# EasyEDA Pro project 不晦启明_srm A.eprj, schematic car

## Sheets
1 MCU: Board Name: Board1; Create Date: 2026-10-12; Page Name: MCU; Project Name: 不晦启明_srm A; Schematic Name: car; Update Date: 2026-10-12; Company: 嘉立创EDA; Page Size: A4; Version: V1.0
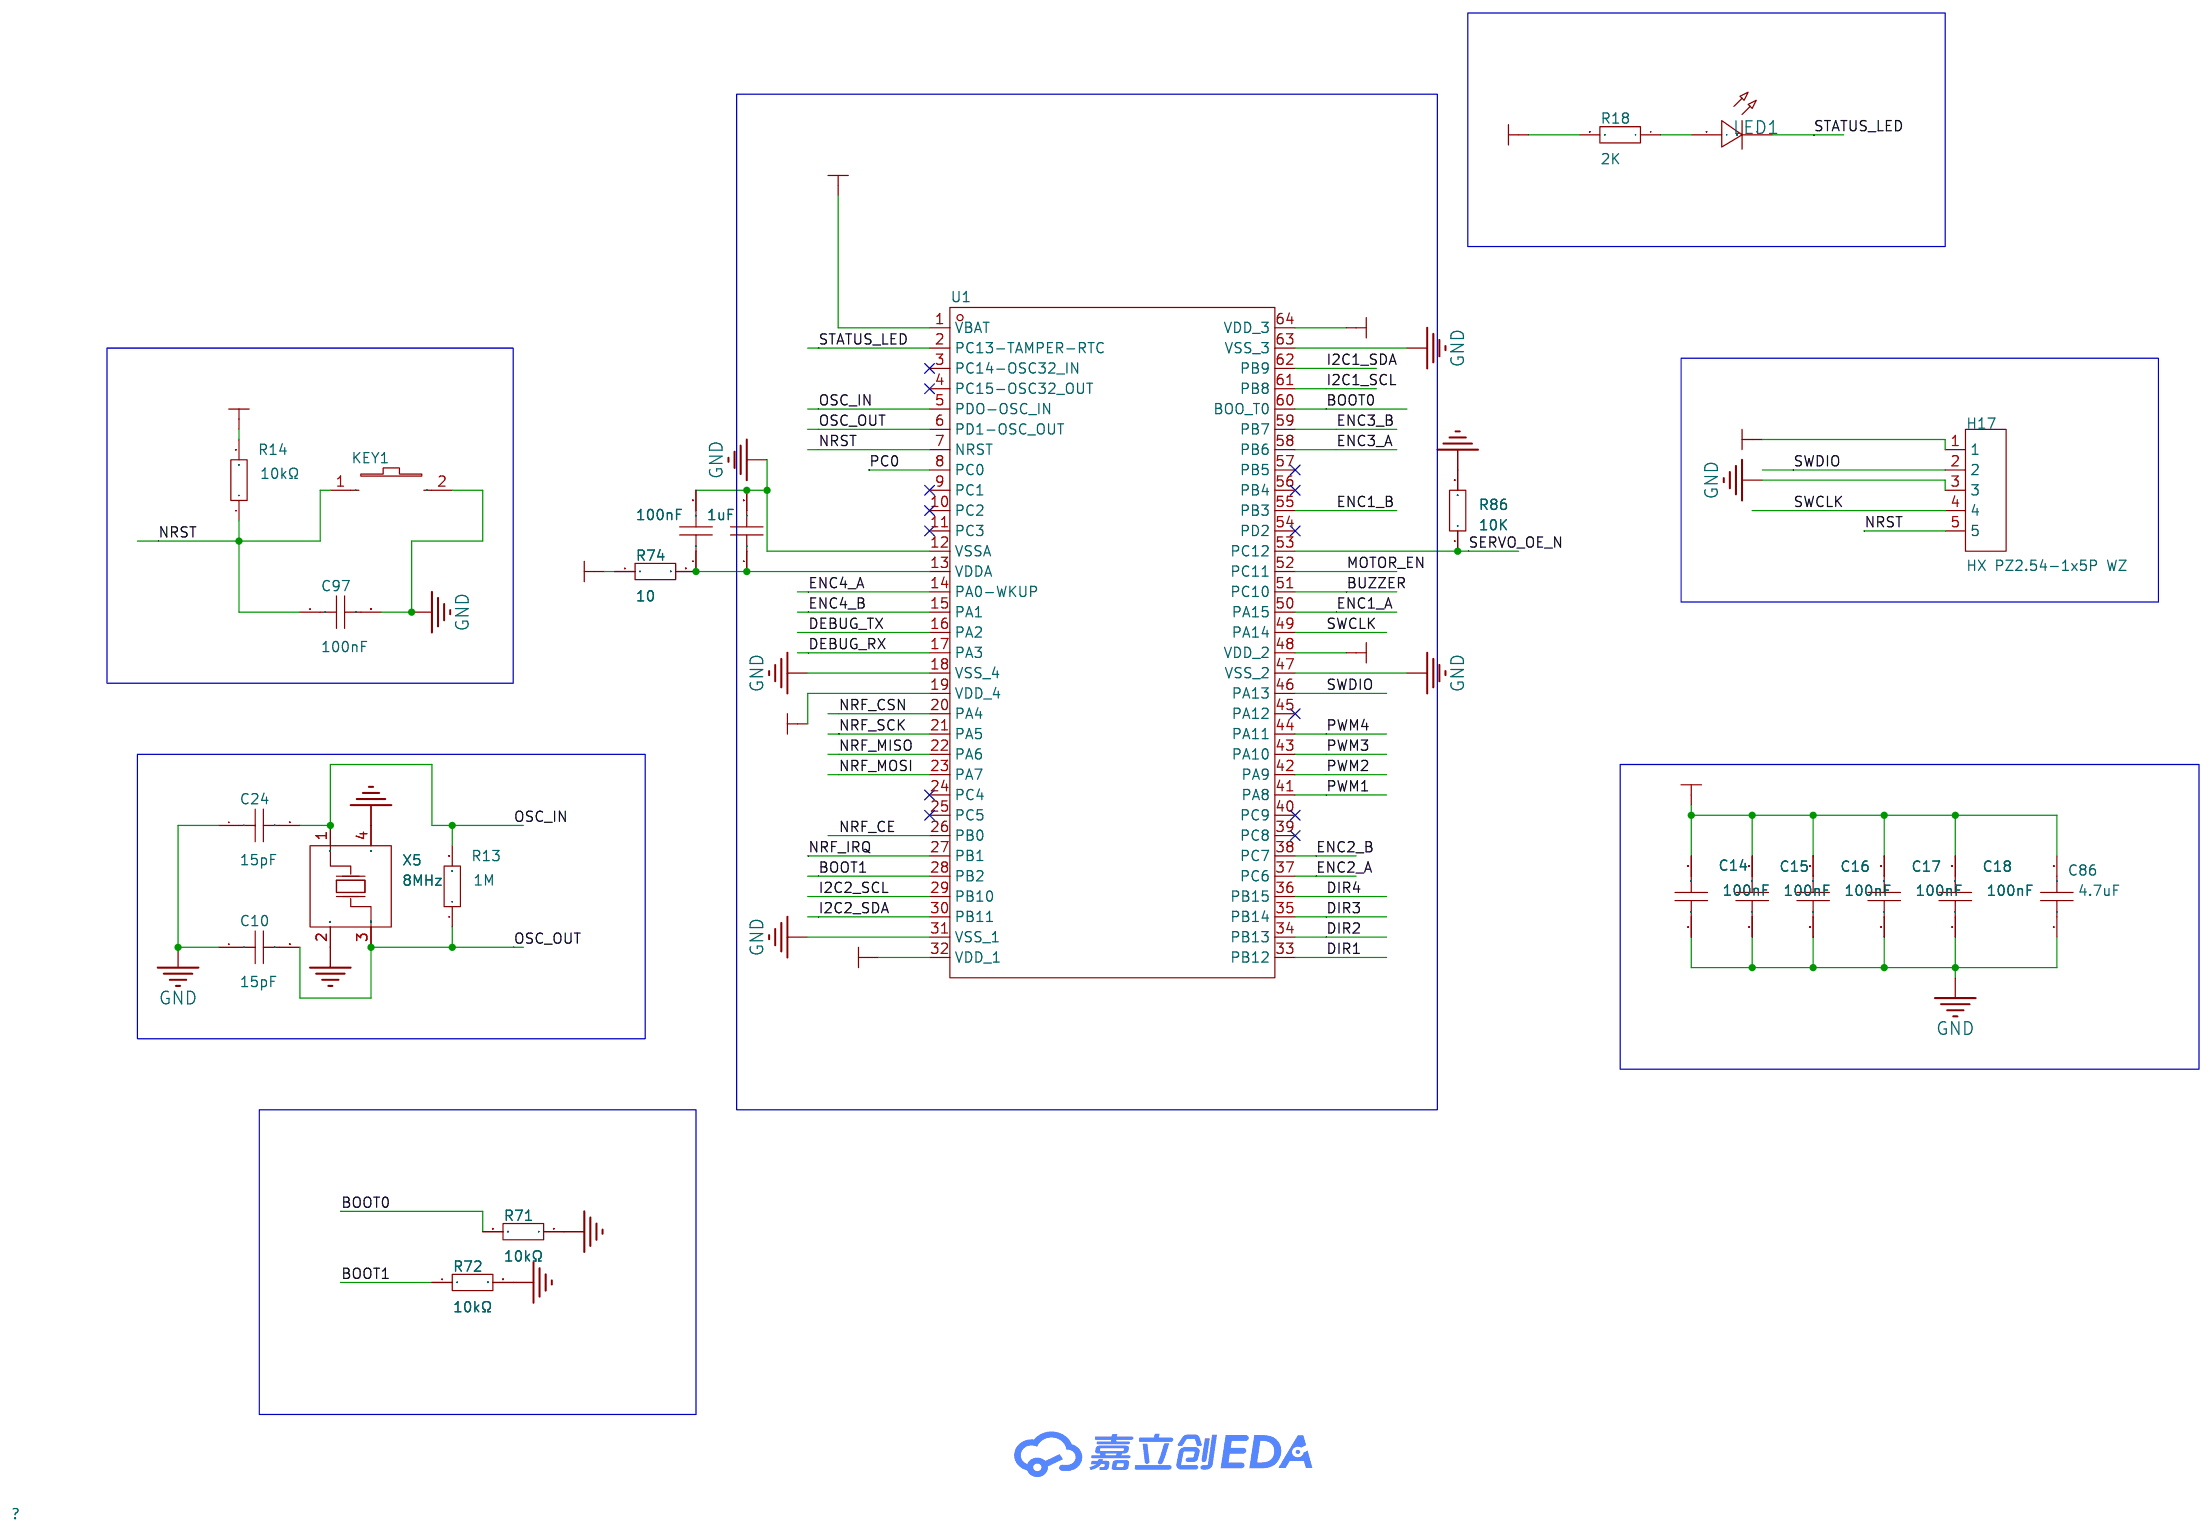
[diagram p0: MCU]
2 电机驱动模块: Create Date: 2026-09-29; Page Name: 电机驱动模块; Project Name: 不晦启明_srm; Update Date: 2026-10-09
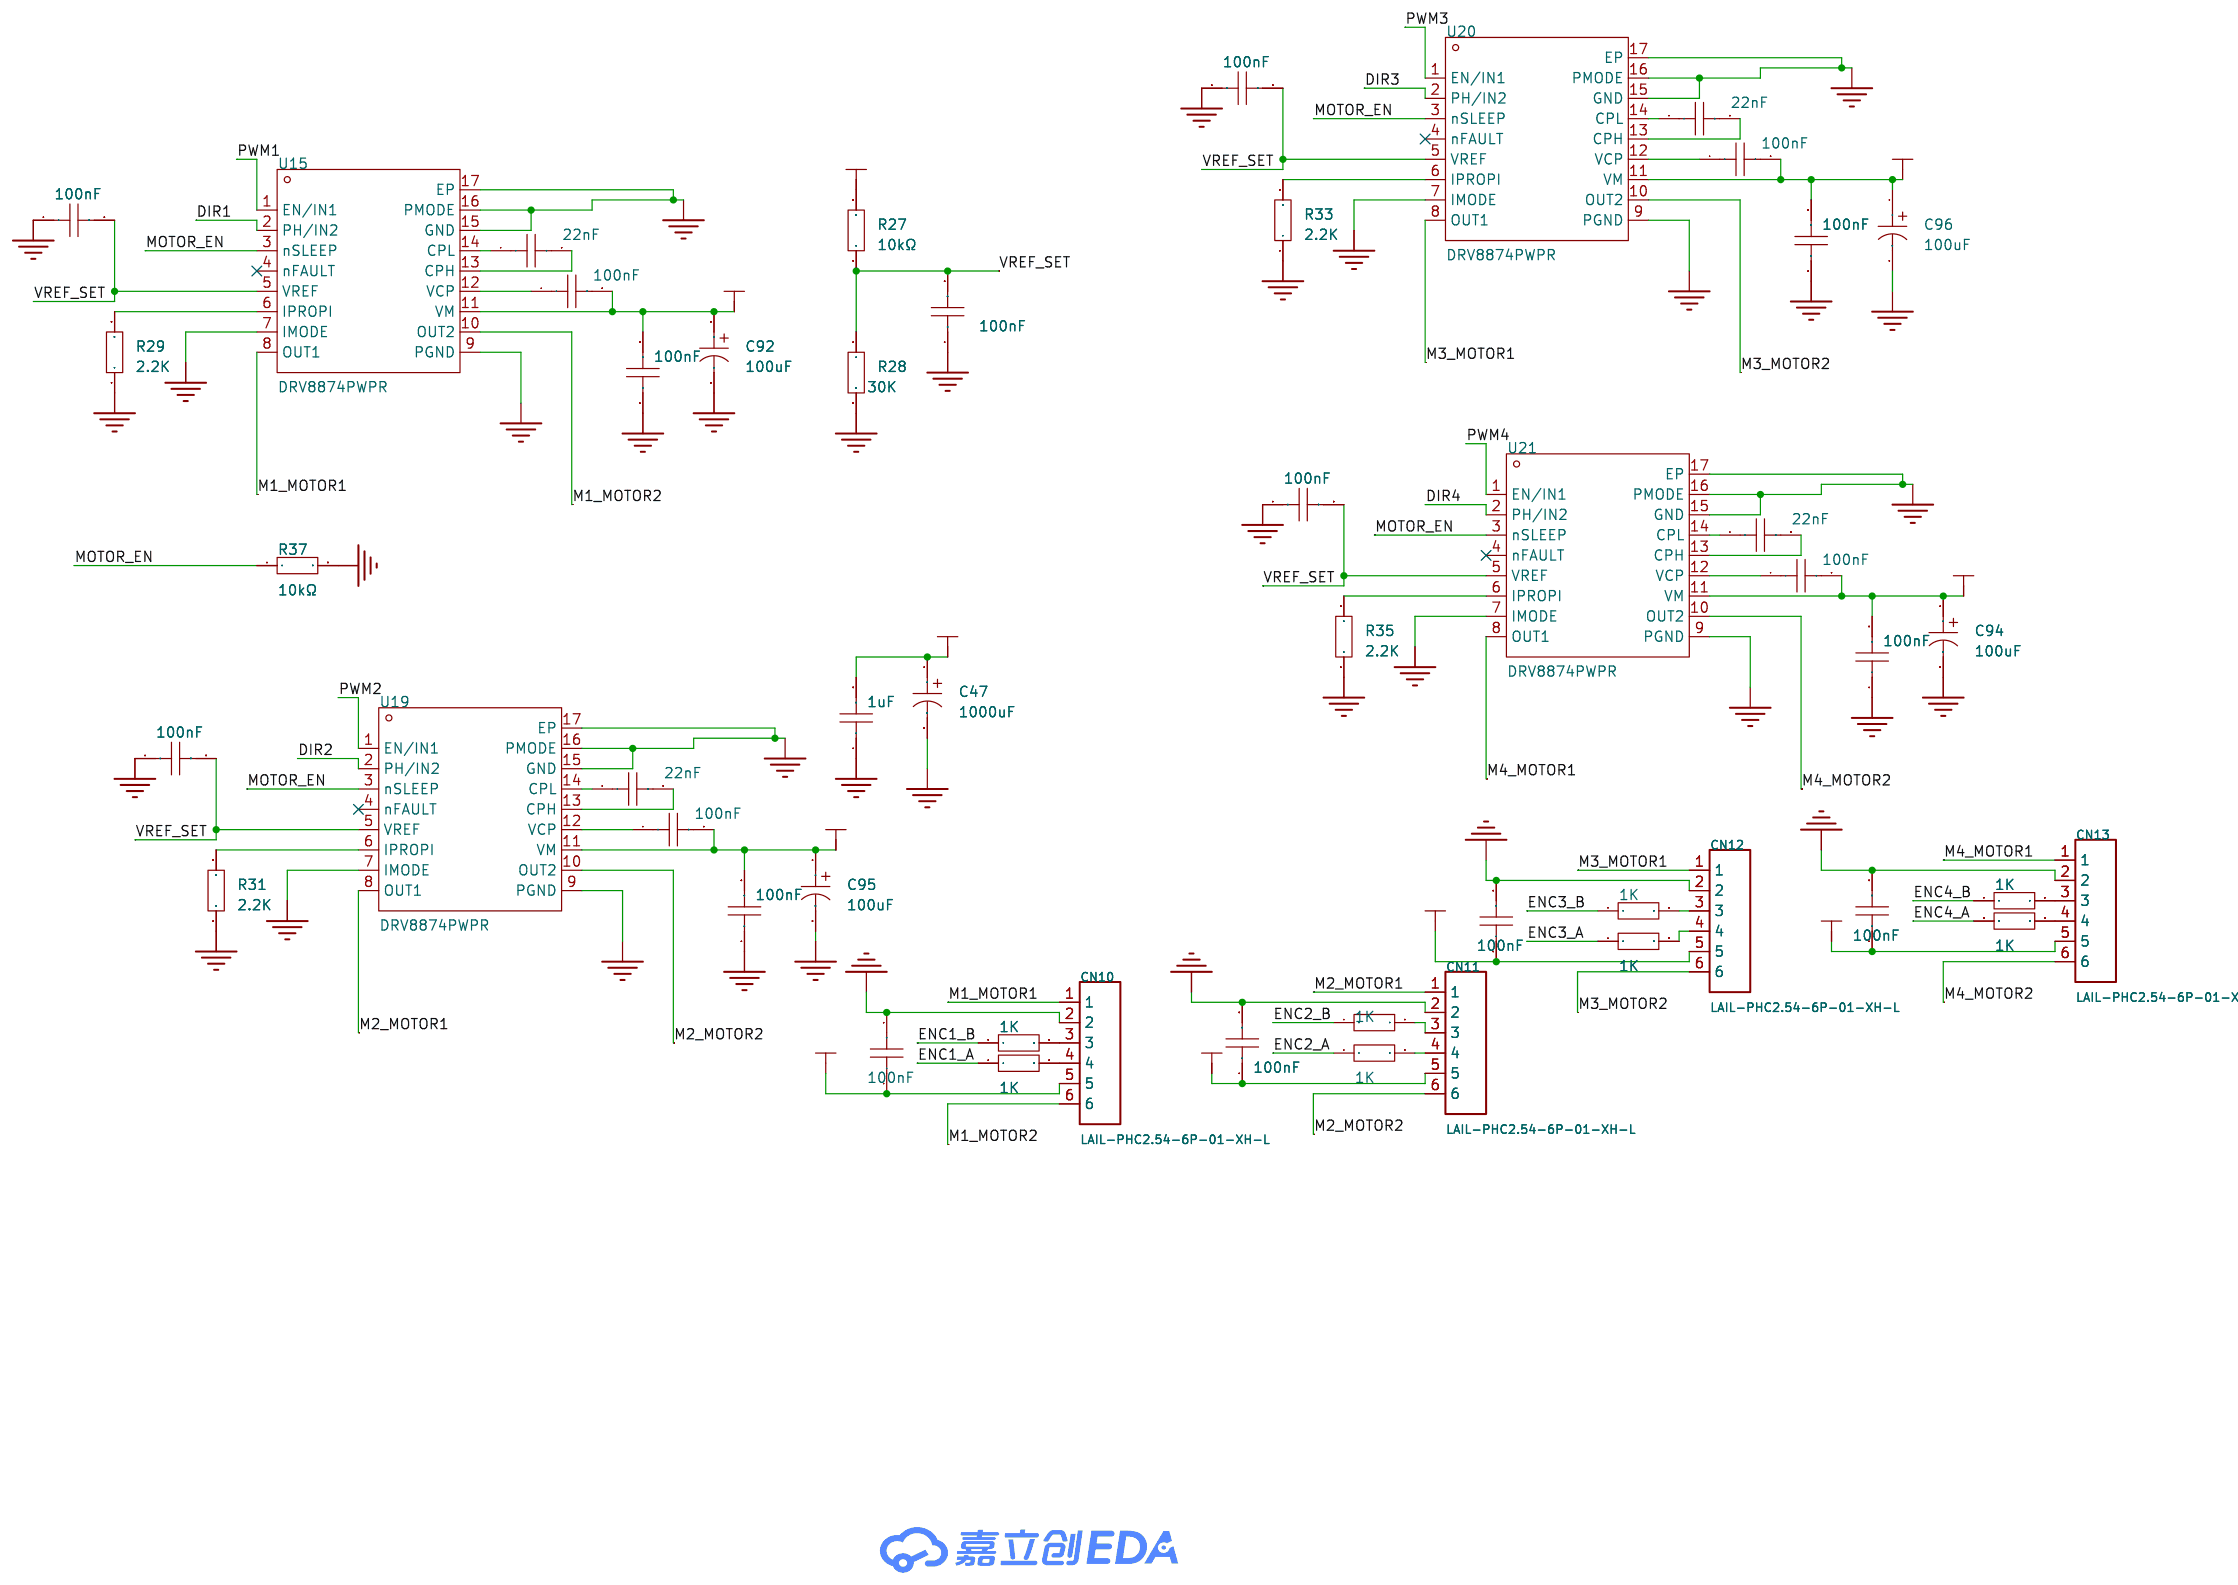
[diagram p1: 电机驱动模块]
3 电源管理: Page Name: 电源管理
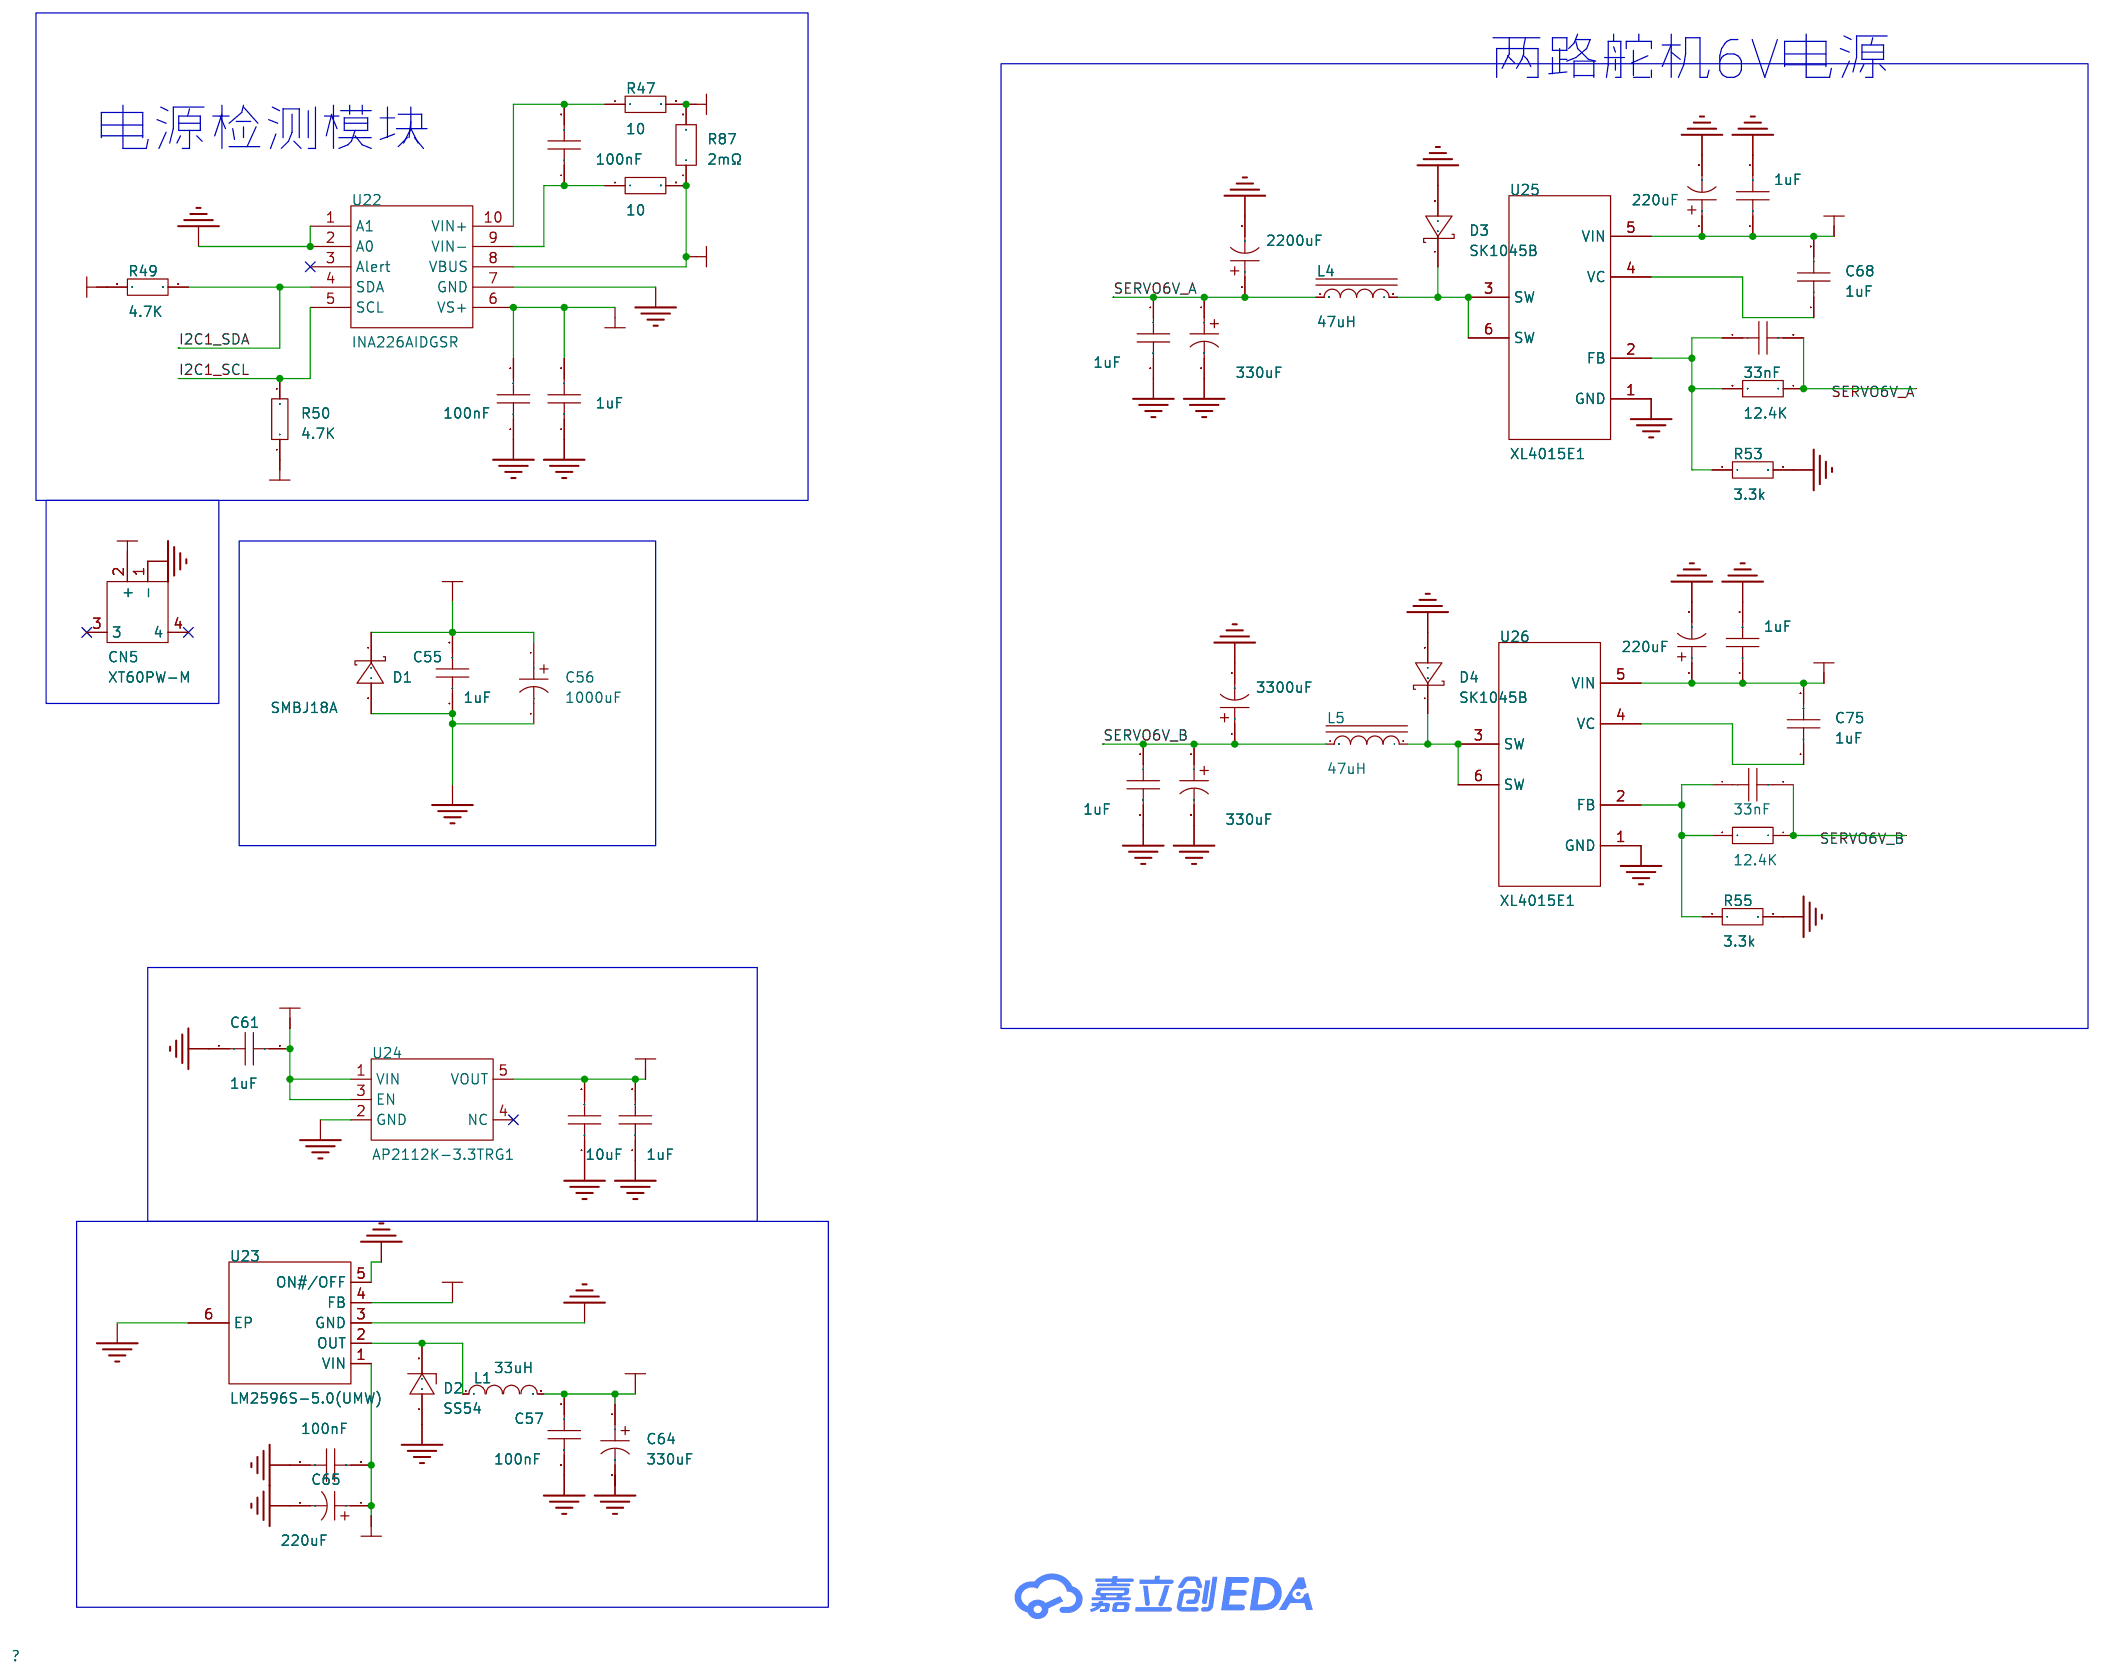
[diagram p2: 电源管理]
4 舵机驱动模块: Create Date: 2026-10-01; Page Name: 舵机驱动模块; Project Name: 不晦启明_srm; Update Date: 2026-10-08
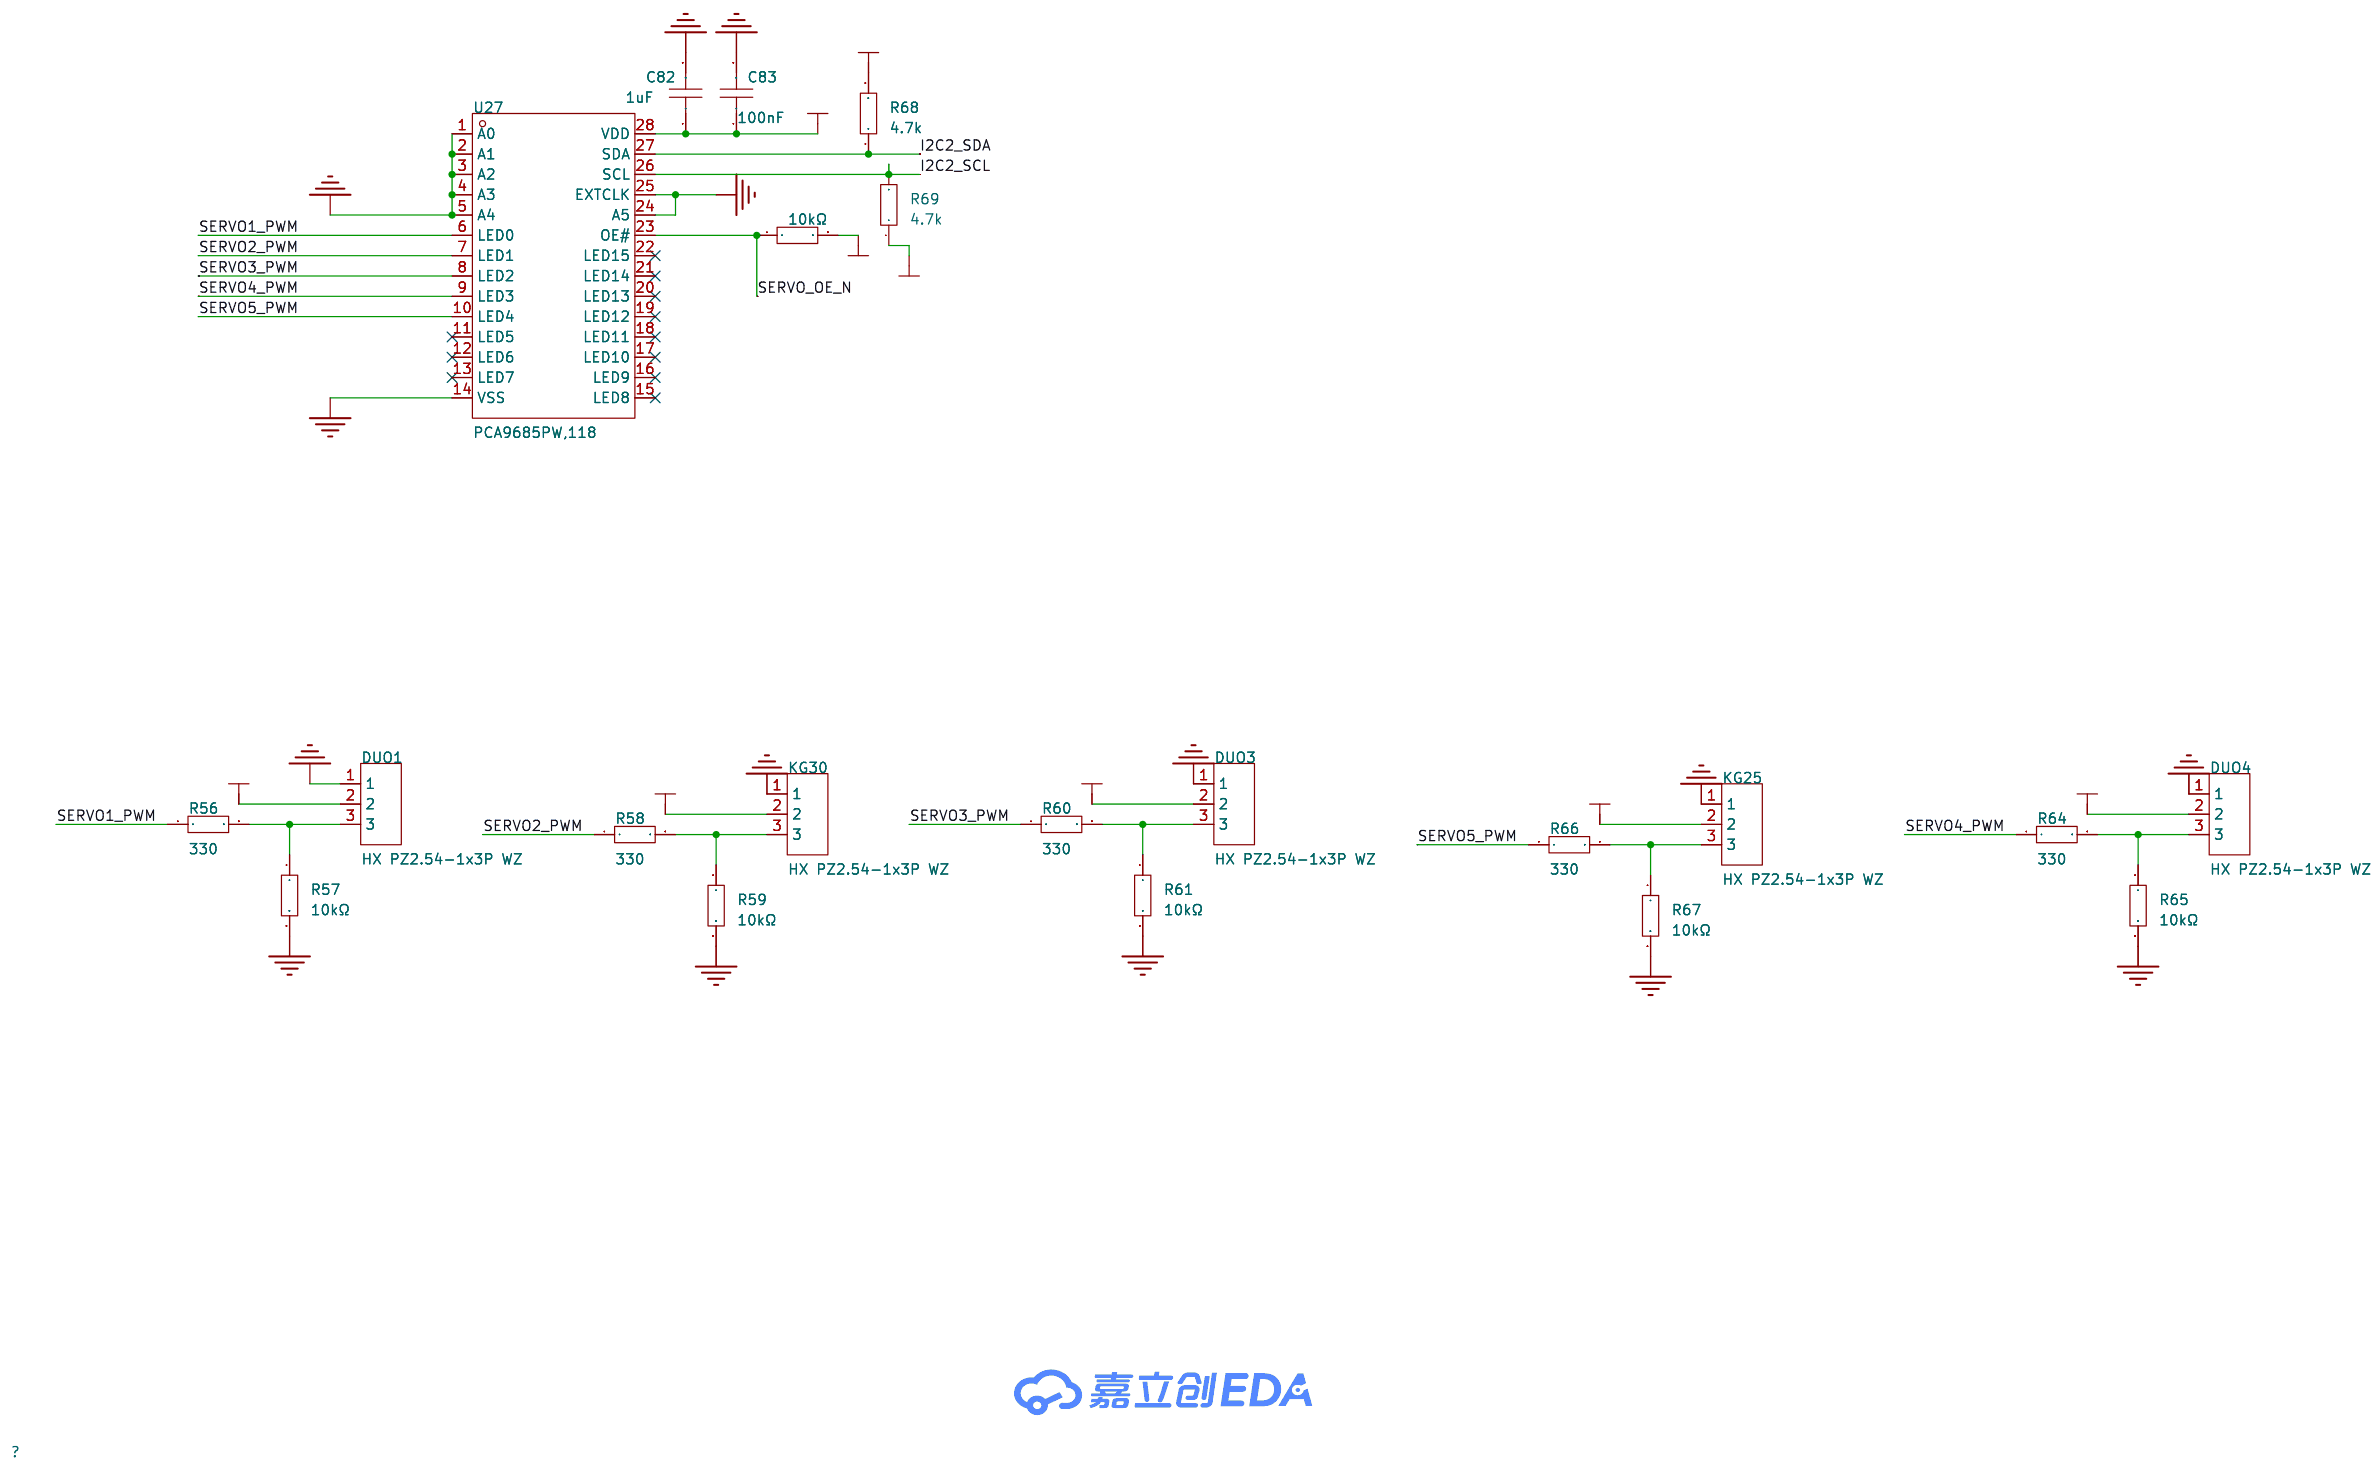
[diagram p3: 舵机驱动模块]
5 无线: Create Date: 2026-10-01; Page Name: 无线; Project Name: 不晦启明_srm; Update Date: 2026-10-01
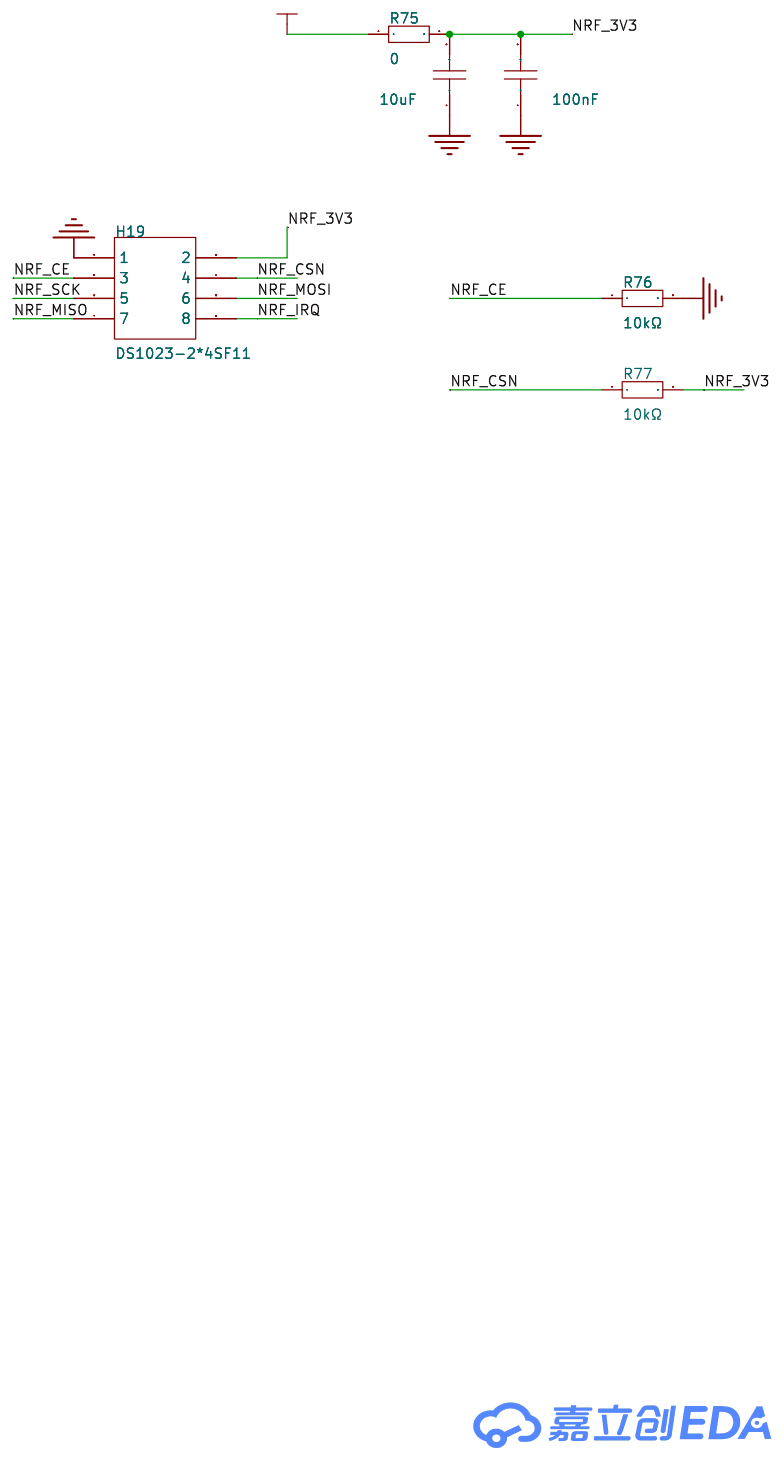
[diagram p4: 无线]
6 oled: Create Date: 2026-10-01; Page Name: oled; Project Name: 不晦启明_srm; Update Date: 2026-10-01
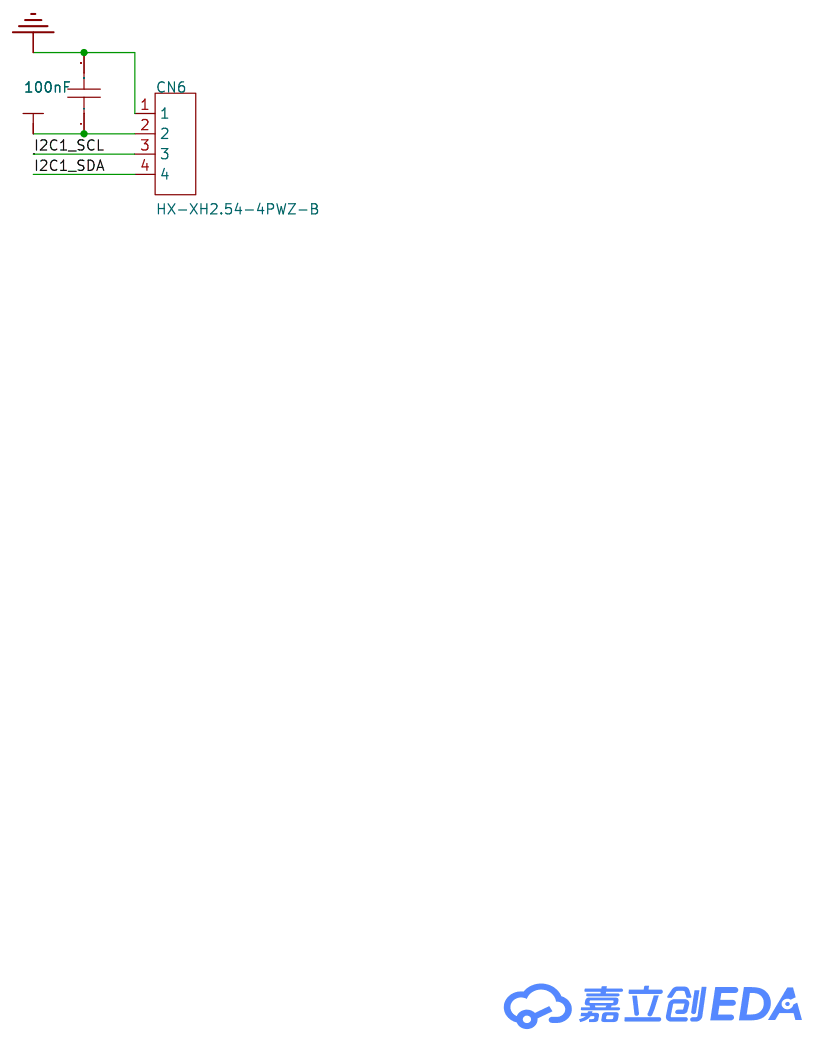
[diagram p5: oled]
7 蜂鸣器和急停: Create Date: 2026-10-01; Page Name: 蜂鸣器和急停; Project Name: 不晦启明_srm; Update Date: 2026-10-02
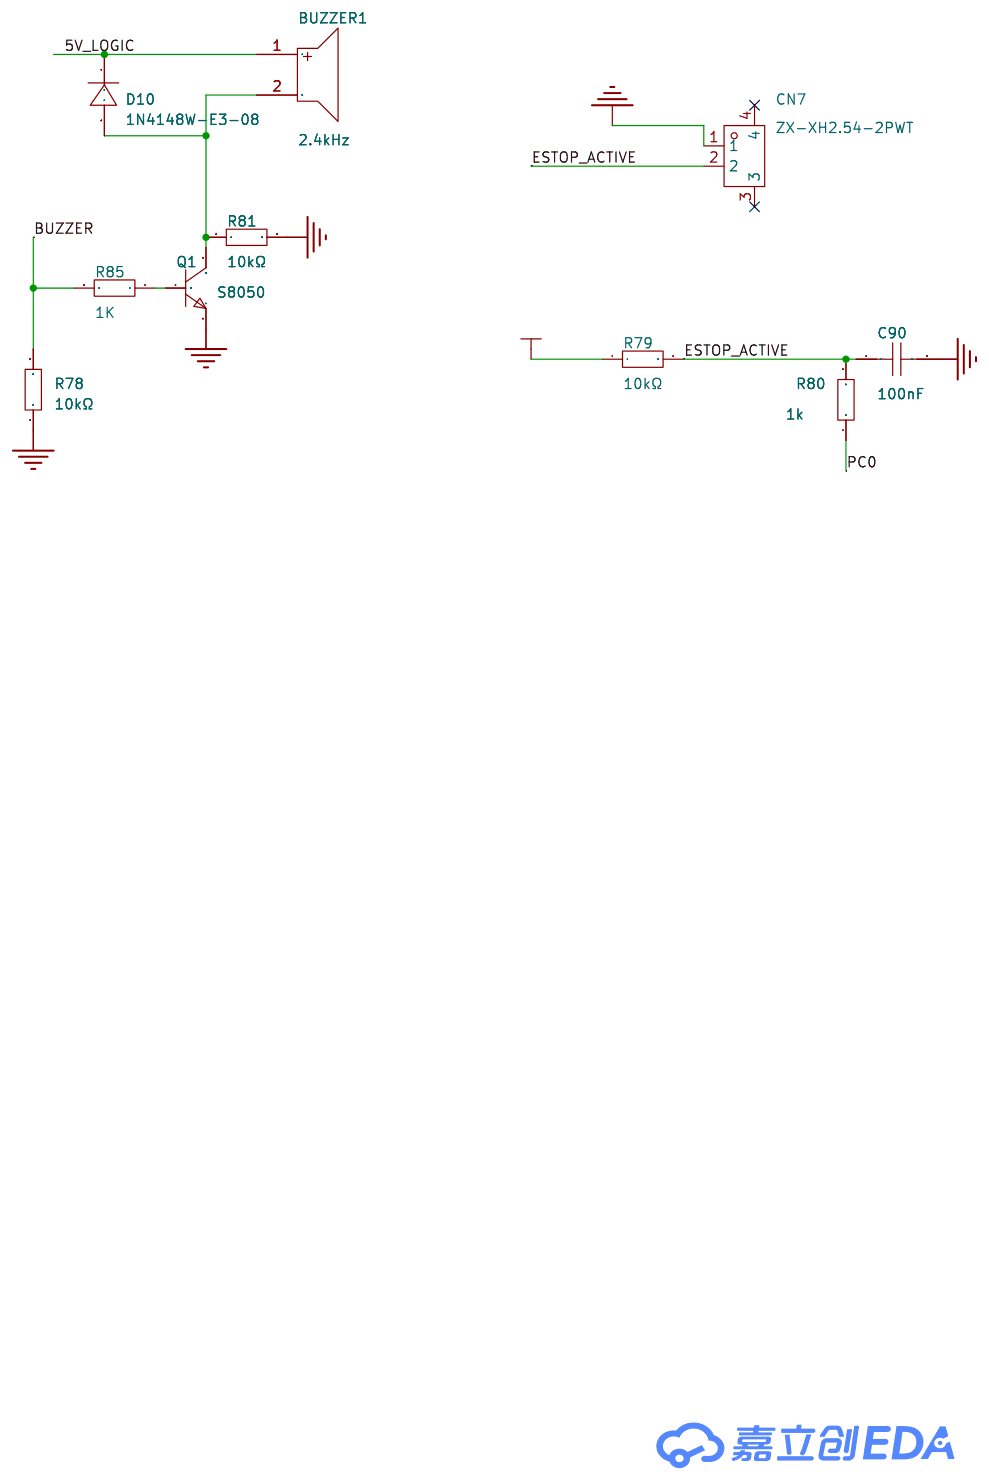
[diagram p6: 蜂鸣器和急停]
8 调试串口: Create Date: 2026-10-01; Page Name: 调试串口; Project Name: 不晦启明_srm; Update Date: 2026-10-02
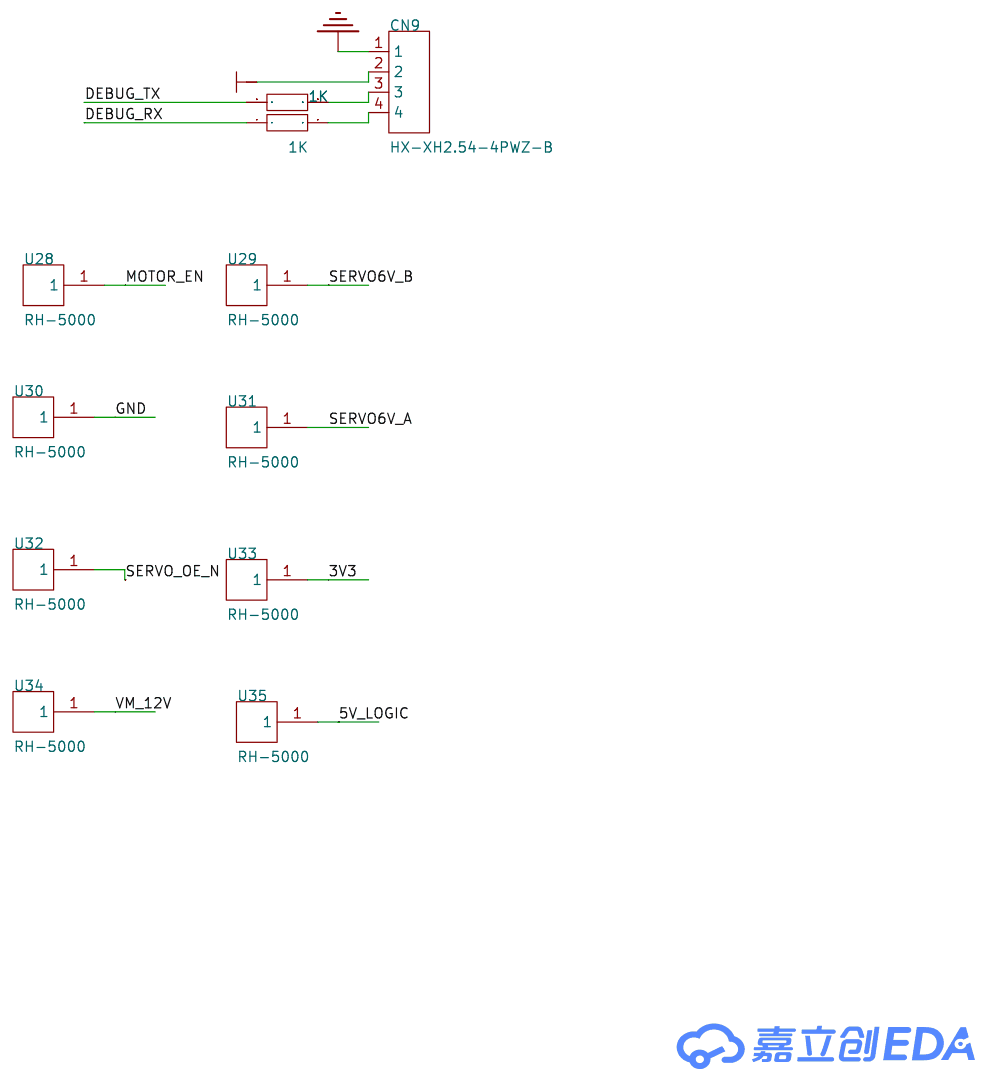
[diagram p7: 调试串口]

## Parts
sheet MCU
C10  15pF  [C0603]
C14  100nF  [C0603]
C15  100nF  [C0603]
C16  100nF  [C0603]
C17  100nF  [C0603]
C18  100nF  [C0603]
C24  15pF  [C0603]
C84  100nF  [C0603]
C85  1uF  [C0603]
C86  4.7uF  [C0603]
C97  100nF  [C0603]
H17  HX PZ2.54-1x5P WZ  [HDR-TH_5P-P2.54-H-M-W10.0-N]
KEY1  轻触开关3x4x2  [SW-SMD_L4.0-W2.9-LS5.0]
LED1  -  [LED0805-RD_RED]
R13  1M  [R0603]
R14  10kΩ  [R0603]
R18  2K  [R0603]
R71  10kΩ  [R0603]
R72  10kΩ  [R0603]
R74  10  [R0603]
R86  10K  [R0603]
U1  -  [LQFP-64_L10.0-W10.0-P0.50-LS12.0-BL]
X5  8MHz  [OSC-SMD_4P-L3.2-W2.5-BL]
sheet oled
C89  100nF  [C0603]
CN6  HX-XH2.54-4PWZ-B  [CONN-TH_HX-XH2.54-4PWZ-B]
sheet 无线
C87  10uF  [C0603]
C88  100nF  [C0603]
H19  DS1023-2*4SF11  [HDR-TH_8P-P2.54-V-F-R2-C4-S2.54]
R75  0  [R0603]
R76  10kΩ  [R0603]
R77  10kΩ  [R0603]
sheet 电机驱动模块
C25  22nF  [C0603]
C26  100nF  [C0603]
C27  100nF  [C0603]
C28  100nF  [C0603]
C30  22nF  [C0603]
C31  100nF  [C0603]
C32  100nF  [C0603]
C33  100nF  [C0603]
C35  22nF  [C0603]
C36  100nF  [C0603]
C37  100nF  [C0603]
C38  100nF  [C0603]
C40  22nF  [C0603]
C41  100nF  [C0603]
C42  100nF  [C0603]
C43  100nF  [C0603]
C45  100nF  [C0603]
C46  1uF  [C0603]
C47  1000uF  [CAP-SMD_BD6.3-L6.6-W6.6-RD]
C48  100nF  [C0603]
C49  100nF  [C0603]
C50  100nF  [C0603]
C51  100nF  [C0603]
C92  100uF  [CAP-TH_BD5.0-P2.00-D0.5-FD]
C94  100uF  [CAP-TH_BD5.0-P2.00-D0.5-FD]
C95  100uF  [CAP-TH_BD5.0-P2.00-D0.5-FD]
C96  100uF  [CAP-TH_BD5.0-P2.00-D0.5-FD]
CN10  LAIL-PHC2.54-6P-01-XH-L  [CONN-TH_AXH-6A-11]
CN11  LAIL-PHC2.54-6P-01-XH-L  [CONN-TH_AXH-6A-11]
CN12  LAIL-PHC2.54-6P-01-XH-L  [CONN-TH_AXH-6A-11]
CN13  LAIL-PHC2.54-6P-01-XH-L  [CONN-TH_AXH-6A-11]
R27  10kΩ  [R0603]
R28  30K  [R0603]
R29  2.2K  [R0603]
R31  2.2K  [R0603]
R33  2.2K  [R0603]
R35  2.2K  [R0603]
R37  10kΩ  [R0603]
R39  1K  [R0603]
R40  1K  [R0603]
R41  1K  [R0603]
R42  1K  [R0603]
R43  1K  [R0603]
R44  1K  [R0603]
R45  1K  [R0603]
R46  1K  [R0603]
U15  DRV8874PWPR  [HTSSOP-16_L5.0-W4.4-P0.65-LS6.4-BL-EP]
U19  DRV8874PWPR  [HTSSOP-16_L5.0-W4.4-P0.65-LS6.4-BL-EP]
U20  DRV8874PWPR  [HTSSOP-16_L5.0-W4.4-P0.65-LS6.4-BL-EP]
U21  DRV8874PWPR  [HTSSOP-16_L5.0-W4.4-P0.65-LS6.4-BL-EP]
sheet 电源管理
C52  100nF  [C0603]
C53  100nF  [C0603]
C54  1uF  [C0603]
C55  1uF  [C0603]
C56  1000uF  [CAP-SMD_BD6.3-L6.6-W6.6-RD]
C57  100nF  [C0603]
C60  100nF  [C0603]
C61  1uF  [C0603]
C62  1uF  [C0603]
C63  10uF  [C0603]
C64  330uF  [CAP-SMD_BD6.3-L6.6-W6.6-RD]
C65  220uF  [CAP-SMD_BD6.3-L6.6-W6.6-RD]
C66  1uF  [C0603]
C67  220uF  [CAP-SMD_BD6.3-L6.6-W6.6-RD]
C68  1uF  [C0603]
C69  1uF  [C0603]
C70  330uF  [CAP-SMD_BD6.3-L6.6-W6.6-RD]
C72  33nF  [C0603]
C73  1uF  [C0603]
C74  220uF  [CAP-SMD_BD6.3-L6.6-W6.6-RD]
C75  1uF  [C0603]
C76  1uF  [C0603]
C77  330uF  [CAP-SMD_BD6.3-L6.6-W6.6-RD]
C79  33nF  [C0603]
C80  2200uF  [CAP-SMD_BD6.3-L6.6-W6.6-RD]
C81  3300uF  [CAP-SMD_BD6.3-L6.6-W6.6-RD]
CN5  XT60PW-M  [CONN-TH_XT60PW-M]
D1  SMBJ18A  [SMB_L4.3-W3.6-LS5.3-RD]
D2  SS54  [SMA_L4.3-W2.6-LS5.0-FD]
D3  SK1045B  [SMB_L4.3-W3.6-LS5.3-RD]
D4  SK1045B  [SMB_L4.3-W3.6-LS5.3-RD]
L1  33uH  [L0603]
L4  47uH  [IND-TH_L22.5-W10.5-P10.00-D1.0]
L5  47uH  [IND-TH_L22.5-W10.5-P10.00-D1.0]
R47  10  [R0603]
R48  10  [R0603]
R49  4.7K  [R0603]
R50  4.7K  [R0603]
R52  12.4K  [R0603]
R53  3.3k  [R0603]
R54  12.4K  [R0603]
R55  3.3k  [R0603]
R87  2mΩ  [RES-SMD_L6.4-W3.2_SD2512]
U22  INA226AIDGSR  [MSOP-10_L3.0-W3.0-P0.50-LS5.0-BL]
U23  LM2596S-5.0(UMW)  [TO-263-5_L10.2-W8.9-P1.70-BR]
U24  AP2112K-3.3TRG1  [SOT-23-5_L2.9-W1.6-P0.95-LS2.8-BR]
U25  XL4015E1  [TO-263-5_L10.2-W8.9-P1.70-TL]
U26  XL4015E1  [TO-263-5_L10.2-W8.9-P1.70-TL]
sheet 舵机驱动模块
C82  1uF  [C0603]
C83  100nF  [C0603]
DUO1  HX PZ2.54-1x3P WZ  [HDR-TH_3P-P2.54-H-M-W10.4-N]
DUO3  HX PZ2.54-1x3P WZ  [HDR-TH_3P-P2.54-H-M-W10.4-N]
DUO4  HX PZ2.54-1x3P WZ  [HDR-TH_3P-P2.54-H-M-W10.4-N]
KG25  HX PZ2.54-1x3P WZ  [HDR-TH_3P-P2.54-H-M-W10.4-N]
KG30  HX PZ2.54-1x3P WZ  [HDR-TH_3P-P2.54-H-M-W10.4-N]
R56  330  [R0603]
R57  10kΩ  [R0603]
R58  330  [R0603]
R59  10kΩ  [R0603]
R60  330  [R0603]
R61  10kΩ  [R0603]
R64  330  [R0603]
R65  10kΩ  [R0603]
R66  330  [R0603]
R67  10kΩ  [R0603]
R68  4.7k  [R0603]
R69  4.7k  [R0603]
R70  10kΩ  [R0603]
U27  PCA9685PW,118  [TSSOP-28_L9.7-W4.4-P0.65-LS6.4-TL]
sheet 蜂鸣器和急停
BUZZER1  2.4kHz  [BUZ-TH_BD12.0-P7.60-D0.6-FD]
C90  100nF  [C0603]
CN7  ZX-XH2.54-2PWT  [CONN-SMD_2P-P2.54_MEGASTAR_ZX-XH2.54-2PWT]
D10  1N4148W-E3-08  [SOD-123_L2.8-W1.8-LS3.7-RD]
Q1  S8050  [SOT-23-3_L2.9-W1.3-P1.90-LS2.3-BR]
R78  10kΩ  [R0603]
R79  10kΩ  [R0603]
R80  1k  [R0603]
R81  10kΩ  [R0603]
R85  1K  [R0603]
sheet 调试串口
CN9  HX-XH2.54-4PWZ-B  [CONN-TH_HX-XH2.54-4PWZ-B]
R83  1K  [R0603]
R84  1K  [R0603]
U28  RH-5000  [TEST-TH_BD2.54-P1.4_RED]
U29  RH-5000  [TEST-TH_BD2.54-P1.4_RED]
U30  RH-5000  [TEST-TH_BD2.54-P1.4_RED]
U31  RH-5000  [TEST-TH_BD2.54-P1.4_RED]
U32  RH-5000  [TEST-TH_BD2.54-P1.4_RED]
U33  RH-5000  [TEST-TH_BD2.54-P1.4_RED]
U34  RH-5000  [TEST-TH_BD2.54-P1.4_RED]
U35  RH-5000  [TEST-TH_BD2.54-P1.4_RED]

## Library data of the parts
C10 C24 = CC0603JRNPO9BN180: 容值:18pF;精度:±5%;额定电压:50V;材质(温度系数):NP0;; LCSC Part Name: 18pF ±5% 50V; Supplier Part: C107040; Manufacturer: YAGEO(国巨); Supplier Footprint: 0603; JLCPCB Part Class: Extended Part; Datasheet: https://atta.szlcsc.com/upload/public/pdf/source/20170420/1492670689750.pdf; Supplier: LCSC; Tolerance: ±5%; Voltage Rated: 50V; Temperature Coefficient: NP0
C14-C18 = CAP_0805: Supplier Footprint: 0805
C28 C33 C38 C43 C45 C46 C48-C55 C57 C60-C63 C66 C68 C69 C72 C73 C75 C76 C79 C82-C90 C97 = CAP_0603: Supplier Footprint: 0603
H17 = HX PZ2.54-1x5P WZ: 插针结构:1x5P;间距:2.54mm;行距:-;圆针/方针:方针;安装方式:弯插;排数:单排;总PIN位数:5P;额定电流:3A;额定电压:1kV;配合针长度:6mm;塑高:2.5mm;端接针长度:3mm;触头材质:黄铜;触头镀层:金;工作温度:-40℃~+105℃;颜色:黑色;; LCSC Part Name: 1x5P 间距:2.54mm 方针 弯插; Supplier Part: C32713264; Manufacturer: hanxia(韩下); Supplier Footprint: 弯插,P=2.54mm; JLCPCB Part Class: 扩展库; Datasheet: https://item.szlcsc.com/datasheet/HX%2520PZ2.54-1x5P%2520WZ/34444544.html; Supplier: LCSC; Pin Structure: 1x5P; Pitch: 2.54mm; Circluar Pins/Square Pins: 方针; Mounting Type: 弯插; Number of Rows: 单排; Number of Pins: 5P; Current Rating: 3A; Voltage Rating (Max): 1kV; Length of Mating Pin: 6mm; Insulation Height: 2.5mm; Length of End Connection Pin: 3mm; Contact Material: 黄铜; Contact Plating: 金; Operating Temperature: -40℃~+105℃; Color: 黑色
KEY1 = 轻触开关3x4x2: 触点电流:50mA;额定电压(DC):12V;电路结构:单刀单掷;安装方式:立贴;按钮形状:圆形按钮;带灯:-;开关长度:4mm;开关宽度:3mm;开关高度:2mm;; LCSC Part Name: 3x4x2  柱高0.5; Supplier Part: C26638; Manufacturer: 国产; Supplier Footprint: SMD; JLCPCB Part Class: 扩展库; Datasheet: https://atta.szlcsc.com/upload/public/pdf/source/20150923/1457707412058.pdf; Supplier: LCSC; Contact Current: 50mA; Voltage Rating (DC): 12V; Circuit: 单刀单掷; Mounting Style: 立贴; Actuator Style: 圆形按钮; Switch Length: 4mm; Switch Width: 3mm; Switch Height: 2mm
LED1 = LED_0805-R: Supplier Footprint: 0805
R13 R18 R28 R29 R31 R33 R35 R39-R50 R52-R56 R58 R60 R64 R66 R68 R69 R74 R75 R80 R83-R86 = Res_0603: Supplier Footprint: 0603
R14 R27 R37 R57 R59 R61 R65 R67 R70-R72 R76-R79 R81 = 0603WAF1002T5E: 电阻类型:厚膜电阻;阻值:10kΩ;精度:±1%;功率:100mW;温度系数:±100ppm/℃;最大工作电压:75V;工作温度范围:-55℃~+155℃;; LCSC Part Name: 10kΩ ±1% 100mW; Supplier Part: C25804; Manufacturer: UNI-ROYAL(厚声); Supplier Footprint: 0603; JLCPCB Part Class: Basic Part; Datasheet: https://atta.szlcsc.com/upload/public/pdf/source/20200306/C422600_1E6D84923E4A46A82E41ADD87F860B5C.pdf; Supplier: LCSC; Type: 厚膜电阻; Tolerance: ±1%; Power(Watts): 100mW; Temperature Coefficient: ±100ppm/℃; Overload Voltage (Max): 75V; Operating Temperature Range: -55℃~+155℃
U1 = STM32F103RCT6: 主频（MAX):72MHz;工作电压:2V ~ 3.6V;; Supplier Part: C8323; Manufacturer: ST(意法半导体); Supplier Footprint: LQFP-64_10x10x05P; JLCPCB Part Class: Extended Part; Datasheet: https://atta.szlcsc.com/upload/public/pdf/source/20161130/1480498797345.pdf; Supplier: LCSC; Speed: 72MHz; Voltage - Supply (Vcc/Vdd): 2V ~ 3.6V; Program Memory Size: 256KB; RAM Size: 48KB; Number of I/O: 51; A/D: 16x12bit; D/A: 2x12bit; PWM: 18; LCD: LCD parallel interface, 8080/6800 modes; UART/USART: 3 USART+2 UART; SPI: 3; I2C（SMBUS/PMBUS）: 2; USB Device: 1; CAN: 1
X5 = TAXM8M4RFDCET2T: 晶振类型:SMD 谐振器;频率:8MHz;频率公差:±20ppm;频率稳定度:±20ppm;负载电容:12pF;等效串联电阻(ESR):250Ω;工作温度:-;; LCSC Part Name: 8MHz ±20ppm 12pF; Supplier Part: C403948; Manufacturer: TAE(雅晶鑫); Supplier Footprint: SMD3225-4P; JLCPCB Part Class: Extended Part; Datasheet: https://atta.szlcsc.com/upload/public/pdf/source/20190712/C403948_DCE244DEF035C9ADCC7C08191B17B6F0.pdf; Supplier: LCSC; Crystal Type: SMD 谐振器; Frequency Tolerance: ±20ppm; Frequency Stability: ±20ppm; Load Capacitance: 12pF; Equivalent Series Resistance (ESR): 250Ω; Check: false
CN6 CN9 = HX-XH2.54-4PWZ-B: 插针结构:1x4P;间距:2.54mm;安装方式:弯插;参考系列:XH;总PIN数:4P;排数:1;每排PIN数:4;行距:-;额定电流:3A;触头材质:黄铜;触头镀层:锡;工作温度:-25℃~+85℃;; LCSC Part Name: 1x4P 间距:2.54mm 弯插 系列:XH; Supplier Part: C49010025; Manufacturer: hanxia(韩下); Supplier Footprint: 弯插,P=2.5mm; JLCPCB Part Class: 扩展库; Datasheet: https://item.szlcsc.com/datasheet/HX-XH2.54-4PWZ-B/51365946.html; Supplier: LCSC; Pins Structure: 1x4P; Pitch: 2.54mm; Mounting Type: 弯插; Reference Series: XH; Number of Pins: 4P; Number of Rows: 1; Number of PINs Per Row: 4; Current Rating: 3A; Contact Material: 黄铜; Contact Plating: 锡; Operating Temperature: -25℃~+85℃; Voltage Rating: 250V; Plastic Material: PA66; Flame Retardant Rating: UL94V-0; Color: 黑色
H19 = DS1023-2*4SF11: 插孔结构:2x4P;间距:2.54mm;行距:2.54mm;安装方式:直插;排数:双排;总孔位数:8P;额定电流:3A;额定电压:600V;插孔方向:顶部;塑高:8.5mm;触头材质:-;触头镀层:金;工作温度:-40℃~+105℃;; LCSC Part Name: 黑色 2x4P 间距:2.54mm 直插; Supplier Part: C92271; Manufacturer: CONNFLY; Supplier Footprint: 插件,P=2.54mm; JLCPCB Part Class: 扩展库; Datasheet: https://item.szlcsc.com/datasheet/DS1023-2*4SF11/93464.html; Supplier: LCSC; Holes Structure: 2x4P; Pitch: 2.54mm; Row Spacing: 2.54mm; Mounting Type: 直插; Number of Rows: 双排; Number of Positions: 8P; Current Rating: 3A; Voltage Rating (Max): 600V; Holes Direction: 顶部; Insulation Height: 8.5mm; Contact Plating: 金; Operating Temperature: -40℃~+105℃
C25 C30 C35 C40 = CL10B223KB8NNNC: 容值:22nF;精度:±10%;额定电压:50V;材质(温度系数):X7R;; LCSC Part Name: 22nF ±10% 50V; Supplier Part: C21122; Manufacturer: SAMSUNG(三星); Supplier Footprint: 0603; JLCPCB Part Class: Basic Part; Datasheet: https://atta.szlcsc.com/upload/public/pdf/source/20160103/1457707705232.pdf; Supplier: LCSC; Tolerance: ±10%; Voltage Rated: 50V; Temperature Coefficient: X7R
C26 C27 C31 C32 C36 C37 C41 C42 = CC0603KRX7R9BB104: 容值:100nF;精度:±10%;额定电压:50V;材质(温度系数):X7R;; LCSC Part Name: 100nF ±10% 50V; Supplier Part: C14663; Manufacturer: YAGEO(国巨); Supplier Footprint: 0603; JLCPCB Part Class: Basic Part; Datasheet: https://atta.szlcsc.com/upload/public/pdf/source/20170116/1484561234239.pdf; Supplier: LCSC; Tolerance: ±10%; Voltage Rated: 50V; Temperature Coefficient: X7R
C47 C56 C64 C65 C67 C70 C74 C77 C80 C81 = MA35V100M6X8: 容值:100uF;精度:±20%;额定电压:35V;纹波电流:2.9A@100kHz;等效串联电阻(ESR):30mΩ@100kHz;类型:聚合物;; LCSC Part Name: 100uF ±20% 35V; Supplier Part: C46550467; Manufacturer: JIERR(捷而瑞); Supplier Footprint: SMD,D6.3xL7.7mm; JLCPCB Part Class: 扩展库; Datasheet: https://item.szlcsc.com/datasheet/MA35V100M6X8/48680161.html; Supplier: LCSC; Tolerance: ±20%; Voltage Rating: 35V; Ripple Current: 2.9A@100kHz; Equivalent Series Resistance(ESR): 30mΩ@100kHz; Type: 聚合物; Diameter: 6.3mm; Height - Seated (Max): 7mm; Lifetime: 2000hrs@105℃; Operating Temperature: -55℃~+105℃; Polarity type: 有极性
C92 C94-C96 = HT1E107M0507PC: 容值:100uF;精度:±20%;额定电压:25V;纹波电流:-;等效串联电阻(ESR):-;类型:-;; LCSC Part Name: 100uF ±20% 25V; Supplier Part: C5438650; Manufacturer: HONOR(荣誉); Supplier Footprint: 插件,D5xL7mm; JLCPCB Part Class: 扩展库; Datasheet: https://item.szlcsc.com/datasheet/HT1E107M0507PC/6315898.html; Supplier: LCSC; Tolerance: ±20%; Voltage Rating: 25V; Pin Spacing: 2mm; Diameter: 5mm; Height - Seated (Max): 7mm; Lifetime: 2000hrs; Operating Temperature: -55℃~+125℃; Polarity type: 有极性
CN10-CN13 = LAIL-PHC2.54-6P-01-XH-L: 插针结构:1x6P;间距:2.54mm;安装方式:直插;参考系列:XH;总PIN数:6P;排数:1;每排PIN数:6;额定电流:3A;触头材质:黄铜;触头镀层:锡;工作温度:-25℃~+85℃;; LCSC Part Name: 1x6P 间距:2.54mm 直插 系列:XH; Supplier Part: C54905977; Manufacturer: LAILAN(莱联); Supplier Footprint: 插件,P=2.5mm; JLCPCB Part Class: 扩展库; Datasheet: https://item.szlcsc.com/datasheet/LAIL-PHC2.54-6P-01-XH-L/58431104.html; Supplier: LCSC; Pins Structure: 1x6P; Pitch: 2.54mm; Mounting Type: 直插; Reference Series: XH; Number of Pins: 6P; Number of Rows: 1; Number of PINs Per Row: 6; Current Rating: 3A; Contact Material: 黄铜; Contact Plating: 锡; Operating Temperature: -25℃~+85℃; Voltage Rating: 250V; Plastic Material: PA66; Flame Retardant Rating: UL94V-0; Color: 白色; Z-Height of the Board: 7.1mm; X-Length of Bottom Edge on Board (Spacing Line): 17.5mm; Y-Width of Bottom Edge on Board: 5.8mm
U15 U19-U21 = DRV8874PWPR: DRV8874 具有集成电流检测反馈功能的 40V、6A H 桥电机驱动器; LCSC Part Name: 6A 有刷直流电机驱动芯片 4.5V~37V; Supplier Part: C1855818; Manufacturer: TI(德州仪器); Supplier Footprint: HTSSOP-16-EP; JLCPCB Part Class: 扩展库; Datasheet: https://www.ti.com/cn/lit/ds/symlink/drv8874.pdf; Supplier: LCSC; Technology: 是; Number of H-bridges: 1; Peak Current: 9A; RDS(on): 200mΩ; Quiescent Current(Iq): 750nA; Operating Temperature: -40℃~+125℃; Features: 交错导通保护；电流采样/调节功能
CN5 = XT60PW-M: 模型锂电连接器; LCSC Part Name: AMASS(艾迈斯)航模插头xt60连接器150公母对接pw锂电池公头 接PCB板卧式 黄色 公头XT60PW-M.G.Y; Supplier Part: C98732; Manufacturer: AMASS(艾迈斯); JLCPCB Part Class: 扩展库; Datasheet: https://item.szlcsc.com/datasheet/XT60PW-M/99942.html; Supplier: LCSC; colour: 黄色; Connector type: 卧式插头; interface form: 公头
D1 = SMBJ18A_C151256: 极性:单向;反向截止电压(Vrwm):18V;钳位电压:29.2V;峰值脉冲电流(Ipp):20.6A@10/1000us;峰值脉冲功率(Ppp):600W@10/1000us;击穿电压(VBR):22.1V;; LCSC Part Name: 单向TVS 18V截止 峰值浪涌电流：20.6A@10/1000us; Supplier Part: C151256; Manufacturer: Littelfuse(美国力特); Supplier Footprint: DO-214AA; JLCPCB Part Class: 扩展库; Datasheet: https://item.szlcsc.com/datasheet/SMBJ18A/162596.html; Supplier: LCSC; Polarity: 单向; Reverse Stand-Off Voltage (Vrwm): 18V; Clamping Voltage: 29.2V; Peak Pulse Current (Ipp): 20.6A@10/1000us; Peak Pulse Power Dissipation (Ppp): 600W@10/1000us; Voltage - Breakdown: 22.1V; Reverse Leakage Current (Ir): 1uA; Number of Channels: 单路; Operating Temperature: -65℃~+150℃; level of protection: IEC 61000-4-2; Type: TVS
D2 = SS54_C7420369: 二极管配置:1个独立式;正向压降(Vf):550mV@5A;直流反向耐压(Vr):40V;整流电流:5A;; LCSC Part Name: 电压:40V 电流:5A; Supplier Part: C7420369; Manufacturer: R+O(宏嘉诚); Supplier Footprint: SMA(DO-214AC); JLCPCB Part Class: 扩展库; Datasheet: https://item.szlcsc.com/datasheet/SS54/8397191.html; Supplier: LCSC; Diode Configuration: 1个独立式; Voltage - Forward(Vf@If): 550mV@5A; Voltage - DC Reverse(Vr): 40V; Current - Rectified: 5A; Reverse Leakage Current (Ir): 200uA@40V; Operating Junction Temperature Range: -55℃~+125℃; Non-Repetitive Peak Forward Surge Current: 120A
D3 D4 = SK1045B_C28646300: 二极管配置:独立式;正向压降(Vf):550mV@10A;直流反向耐压(Vr):45V;整流电流:10A;; LCSC Part Name: 电压:45V 电流:10A; Supplier Part: C28646300; Manufacturer: R+O(宏嘉诚); Supplier Footprint: SMB; JLCPCB Part Class: 扩展库; Datasheet: https://item.szlcsc.com/datasheet/SK1045B/30381046.html; Supplier: LCSC; Diode Configuration: 独立式; Voltage - Forward(Vf@If): 550mV@10A; Voltage - DC Reverse(Vr): 45V; Current - Rectified: 10A; Reverse Leakage Current (Ir): 100uA@45V; Operating Junction Temperature Range: -55℃~+150℃; Non-Repetitive Peak Forward Surge Current: 250A
L1 = L_0603
L4 L5 = XR6826T470MVL9: 电感值:47uH;精度:±10%;额定电流:6A;饱和电流(Isat):9A;类型:环形电感;; Supplier Part: C22447597; Manufacturer: XR(祥如); Supplier Footprint: 插件,D=22.5mm; JLCPCB Part Class: 扩展库; Datasheet: https://item.szlcsc.com/datasheet/XR6826T470MVL9/24104794.html; Supplier: LCSC; Tolerance: ±10%; Current Rating: 6A; Current - Saturation(Isat): 9A; Type: 环形电感; Wire Diameter: 0.9mm
R87 = FPM253WFR002TML: 电阻类型:采样电阻;阻值:2mΩ;精度:±1%;功率:3W;温度系数:±50ppm/℃;安装方式:贴片;; LCSC Part Name: 2mΩ ±1% 3W 合金电阻; Supplier Part: C7420017; Manufacturer: FOJAN(富捷); Supplier Footprint: 2512; JLCPCB Part Class: 扩展库; Datasheet: https://item.szlcsc.com/datasheet/FPM253WFR002TML/8395310.html; Supplier: LCSC; Type: 采样电阻; Tolerance: ±1%; Power(Watts): 3W; Temperature Coefficient: ±50ppm/℃; Mounting Type: 贴片
U22 = INA226AIDGSR: 放大器数:-;共模电压:0V~36V;增益:-;带宽(-3db):-;; LCSC Part Name: 高侧/低侧测量双向电流/功率监视器，具有I²C兼容接口; Supplier Part: C49851; Manufacturer: TI(德州仪器); Supplier Footprint: VSSOP-10; JLCPCB Part Class: 扩展库; Datasheet: https://www.ti.com/cn/lit/ds/symlink/ina226.pdf; Supplier: LCSC; Vcm - Common Mode Voltage: 0V~36V; Ib - Input Bias Current: 100pA; Vos - Input Offset Voltage: 2.5uV; Operating Temperature: -40℃~+125℃; Differential Voltage: ±40V; Single Supply: 2.7V~5.5V; Quiescent Current: 330uA; Input Offset Voltage Drift(Vos TC): 0.1uV/℃; Common Mode Rejection Ratio (CMRR): 140dB; Features: 可编程阈值告警；使能/关断功能；双向检测；数字输出接口；高边检测；低边检测；功率监控
U23 = LM2596S-5.0(UMW): 功能类型:降压型;工作电压:7V~40V;输出电压:5V;输出电流:3A;输出类型:固定;; LCSC Part Name: 降压型 3A 7V~40V; Supplier Part: C347421; Manufacturer: UMW(友台半导体); Supplier Footprint: TO-263-5; JLCPCB Part Class: 扩展库; Datasheet: https://item.szlcsc.com/datasheet/LM2596S-5.0(UMW)/324081.html; Supplier: LCSC; Function: 降压型; Voltage - Supply: 7V~40V; Output Voltage: 5V; Output Current: 3A; Frequency - Switching: 150kHz; Operating Temperature: -40℃~+125℃@(TA); Synchronous Rectifier: 否; Number of Outputs: 1; Topology: 降压式; Quiescent Current: 80uA; Switch tube (built-in/external): 内置; Output Type: 固定; Features: 过流保护
U24 = AP2112K-3.3TRG1_C23380830: 输出极性:正极;工作电压:5.5V;输出电压:3.3V;输出电流:600mA;电源纹波抑制比(PSRR):75dB@(1kHz);输出类型:固定;; LCSC Part Name: 3.3V 600mA 5.5V; Supplier Part: C23380830; Manufacturer: TECH PUBLIC(台舟); Supplier Footprint: SOT-23-5; JLCPCB Part Class: 扩展库; Datasheet: https://item.szlcsc.com/datasheet/AP2112K-3.3TRG1/25111500.html; Supplier: LCSC; Output Configuration: 正极; Voltage - Supply: 5.5V; Output Voltage: 3.3V; Output Current: 600mA; Power Supply Rejection Ratio (PSRR): 75dB@(1kHz); Voltage Dropout: 320mV@(600mA); standby current: 10uA; Features: 使能控制；过流保护；输出放电；热关断; Operating Temperature: -40℃~+85℃@(Ta); Output Type: 固定; Number of Outputs: 1
U25 U26 = XL4015E1: 功能类型:降压型;工作电压:8V~36V;输出电压:1.25V~32V;输出电流:5A;输出类型:可调;; LCSC Part Name: 降压型 5A 8V~36V; Supplier Part: C51661; Manufacturer: XLSEMI(芯龙); Supplier Footprint: TO-263-5; JLCPCB Part Class: 扩展库; Datasheet: https://item.szlcsc.com/datasheet/XL4015E1/52674.html; Supplier: LCSC; Function: 降压型; Voltage - Supply: 8V~36V; Output Voltage: 1.25V~32V; Output Current: 5A; Frequency - Switching: 180kHz; Operating Temperature: -40℃~+125℃; Synchronous Rectifier: 否; Number of Outputs: 1; Topology: 降压式; Quiescent Current: 5mA; Switch tube (built-in/external): 内置; Output Type: 可调; Features: 过流保护
DUO1 DUO3 DUO4 KG25 KG30 = HX PZ2.54-1x3P WZ: 插针结构:1x3P;间距:2.54mm;行距:-;圆针/方针:方针;安装方式:弯插;排数:单排;总PIN位数:3P;额定电流:3A;额定电压:1kV;配合针长度:6mm;塑高:2.5mm;端接针长度:3mm;触头材质:黄铜;触头镀层:金;工作温度:-40℃~+105℃;颜色:黑色;; LCSC Part Name: 1x3P 间距:2.54mm 方针 弯插; Supplier Part: C32713262; Manufacturer: hanxia(韩下); Supplier Footprint: 弯插,P=2.54mm; JLCPCB Part Class: 扩展库; Datasheet: https://item.szlcsc.com/datasheet/HX%2520PZ2.54-1x3P%2520WZ/34444542.html; Supplier: LCSC; Pin Structure: 1x3P; Pitch: 2.54mm; Circluar Pins/Square Pins: 方针; Mounting Type: 弯插; Number of Rows: 单排; Number of Pins: 3P; Current Rating: 3A; Voltage Rating (Max): 1kV; Length of Mating Pin: 6mm; Insulation Height: 2.5mm; Length of End Connection Pin: 3mm; Contact Material: 黄铜; Contact Plating: 金; Operating Temperature: -40℃~+105℃; Color: 黑色
U27 = PCA9685PW,118: 类型:-;工作电压(DC):2.3V~5.5V;开关频率:100kHz~1MHz;通道数:16;输出电压:5.5V;输出电流:25mA;调光:PWM;; LCSC Part Name: 16通道、12位PWM Fm+ I2C总线LED控制器; Supplier Part: C2678753; Manufacturer: NXP(恩智浦); Supplier Footprint: TSSOP-28; JLCPCB Part Class: 扩展库; Datasheet: https://www.nxp.com.cn/docs/en/data-sheet/PCA9685.pdf; Supplier: LCSC; Voltage - Input(DC): 2.3V~5.5V; Frequency - Switching: 100kHz~1MHz; Number of Channels: 16; Output Voltage: 5.5V; Output Current: 25mA; Dimming: PWM; Operating temperature: -40℃~+85℃; Switch Tube (Built-In/External): 内置
BUZZER1 = TMB12A05_C49246931: 驱动方式:有源(内含驱动线路);构造类型:电磁式;额定电压:5V;频率:2.4kHz;声压(SPL):85dB;; LCSC Part Name: 蜂鸣器; Supplier Part: C49246931; Manufacturer: XHXDZ(兴华鑫); Manufacturer Part: TMB12A05; Supplier Footprint: 插件,D12xL9.5mm; JLCPCB Part Class: 扩展库; Datasheet: https://item.szlcsc.com/datasheet/TMB12A05/51674900.html; Supplier: LCSC; Driver Circuitry: 有源(内含驱动线路); Technology: 电磁式; Voltage Rating: 5V; Voltage - Supply: 3V~7V; Current Consumption: 30mA; Sound Pressure Level(SPL): 85dB; Diameter(φD): 12mm; Height: 9.5mm; Operating Temperature: -30℃~+70℃
CN7 = ZX-XH2.54-2PWT: 插针结构:1x2P;间距:2.5mm;安装方式:卧贴;参考系列:XH;总PIN数:2P;排数:1;每排PIN数:2;行距:-;额定电流:3A;触头材质:黄铜;触头镀层:锡;工作温度:-25℃~+85℃;; LCSC Part Name: 1x2P 间距:2.5mm 卧贴 系列:XH; Supplier Part: C7429671; Manufacturer: Megastar(兆星); Supplier Footprint: SMD,P=2.5mm,卧贴; JLCPCB Part Class: 扩展库; Datasheet: https://item.szlcsc.com/datasheet/ZX-XH2.54-2PWT/8427588.html; Supplier: LCSC; Pins Structure: 1x2P; Pitch: 2.5mm; Mounting Type: 卧贴; Reference Series: XH; Number of Pins: 2P; Number of Rows: 1; Number of PINs Per Row: 2; Current Rating: 3A; Contact Material: 黄铜; Contact Plating: 锡; Operating Temperature: -25℃~+85℃; Voltage Rating: 250V; Plastic Material: LCP; Supplementary Features: 辅助焊脚; Color: 米色; Z-Height of the Board: 6.2mm; X-Length of Bottom Edge on Board (Spacing Line): 10mm; Y-Width of Bottom Edge on Board: 7.8mm
D10 = 1N4148W-E3-08: 二极管配置:1个独立式;整流电流:150mA;直流反向耐压(Vr):75V;正向压降(Vf):1.2V@100mA;反向恢复时间(Trr):4ns;; LCSC Part Name: 75V 150mA; Supplier Part: C241939; Manufacturer: VISHAY(威世); Supplier Footprint: SOD-123; JLCPCB Part Class: 扩展库; Datasheet: https://item.szlcsc.com/datasheet/1N4148W-E3-08/240783.html; Supplier: LCSC; Diode Configuration: 1个独立式; Pd - Power Dissipation: 350mW; Current - Rectified: 150mA; Voltage - DC Reverse(Vr): 75V; Voltage - Forward(Vf@If): 1.2V@100mA; Non-Repetitive Peak Forward Surge Current: 2A; Reverse Leakage Current (Ir): 100uA@100V; Reverse Recovery Time (trr): 4ns; Operating Junction Temperature Range: -55℃~+150℃
Q1 = S8050_C20069125: 晶体管类型:NPN;集电极电流(Ic):500mA;集射极击穿电压(Vceo):25V;耗散功率(Pd):300mW;直流电流增益(hFE):120;; LCSC Part Name: hFE:200-350，丝印:J3Y NPN 500mA 25V; Supplier Part: C20069125; Manufacturer: R+O(宏嘉诚); Supplier Footprint: SOT-23; JLCPCB Part Class: 扩展库; Datasheet: https://item.szlcsc.com/datasheet/S8050/21397163.html; Supplier: LCSC; type: NPN; Current - Collector(Ic): 500mA; Collector - Emitter Voltage VCEO: 25V; Pd - Power Dissipation: 300mW; DC Current Gain: 120; Transition frequency(fT): 100MHz; Current - Collector Cutoff: 100nA; Vce Saturation(VCE(sat)): 600mV; Operating Temperature: -55℃~+150℃; Emitter-Base Voltage(Vebo): 5V; Number: 1个NPN; Configuration: 独立式
U28-U35 = RH-5000: LCSC Part Name: PCB电路板测试点/测试针; Supplier Part: C5277086; Manufacturer: 荣和; JLCPCB Part Class: 扩展库; Datasheet: https://item.szlcsc.com/datasheet/RH-5000/6009931.html; Supplier: LCSC; Connector Type: 插针型(穿板); Plastic Color: 红色; Board Space (Diameter φ/ Length x Width): 2.5mm

## Nets
3V3: C14.2 C15.2 C16.2 C17.2 C18.2 C48.1 C49.1 C50.1 C51.1 C53.2 C54.2 C62.2 C63.2 C82.1 C83.1 C86.2 C89.1 CN6.2 CN9.2 CN10.5 CN11.5 CN12.5 CN13.5 H17.1 R14.2 R18.2 R27.2 R49.2 R50.1 R68.2 R69.1 R70.2 R74.1 R75.1 R79.1 U1.1(VBAT) U1.19(VDD_4) U1.32(VDD_1) U1.48(VDD_2) U1.64(VDD_3) U22.6(VS+) U24.5(VOUT) U27.28(VDD) U33.1
5V_LOGIC: BUZZER1.1 C57.1 C61.2 C64.1 D10.1(K) L1.2 U23.4(FB) U24.1(VIN) U24.3(EN) U35.1
GND: C10.1 C14.1 C15.1 C16.1 C17.1 C18.1 C24.1 C27.1 C28.1 C32.1 C33.1 C37.1 C38.1 C42.1 C43.1 C45.1 C46.1 C47.2 C48.2 C49.2 C50.2 C51.2 C53.1 C54.1 C55.1 C56.2 C57.2 C60.1 C61.1 C62.1 C63.1 C64.2 C65.2 C66.2 C67.2 C69.2 C70.2 C73.2 C74.2 C76.2 C77.2 C80.2 C81.2 C82.2 C83.2 C84.2 C85.2 C86.1 C87.1 C88.1 C89.2 C90.2 C92.2 C94.2 C95.2 C96.2 C97.2 CN5.1(-) CN6.1 CN7.1 CN9.1 CN10.2 CN11.2 CN12.2 CN13.2 D1.2(A) D2.1(A) D3.2(A) D4.2(A) DUO1.1 DUO3.1 DUO4.1 H17.3 H19.1 KEY1.2 KG25.1 KG30.1 Q1.2(E) R28.2 R29.1 R31.1 R33.1 R35.1 R37.2 R53.2 R55.2 R57.2 R59.2 R61.2 R65.2 R67.2 R71.1 R72.2 R76.2 R78.1 R81.2 R86.2 U1.12(VSSA) U1.18(VSS_4) U1.31(VSS_1) U1.47(VSS_2) U1.63(VSS_3) U15.7(IMODE) U15.9(PGND) U15.15(GND) U15.16(PMODE) U15.17(EP) U19.7(IMODE) U19.9(PGND) U19.15(GND) U19.16(PMODE) U19.17(EP) U20.7(IMODE) U20.9(PGND) U20.15(GND) U20.16(PMODE) U20.17(EP) U21.7(IMODE) U21.9(PGND) U21.15(GND) U21.16(PMODE) U21.17(EP) U22.1(A1) U22.2(A0) U22.7(GND) U23.3(GND) U23.5(ON#/OFF) U23.6(EP) U24.2(GND) U25.1(GND) U26.1(GND) U27.1(A0) U27.2(A1) U27.3(A2) U27.4(A3) U27.5(A4) U27.14(VSS) U27.24(A5) U27.25(EXTCLK) U30.1 X5.2(GND) X5.4(GND)
BAT_IN+: CN5.2(+) R47.2 R87.2
BOOT0: R71.2 U1.60(BOO_T0)
BOOT1: R72.1 U1.28(PB2)
BUZZER: R78.2 R85.2 U1.51(PC10)
DEBUG_RX: R84.1 U1.17(PA3)
DEBUG_TX: R83.1 U1.16(PA2)
DIR1: U1.33(PB12) U15.2(PH/IN2)
DIR2: U1.34(PB13) U19.2(PH/IN2)
DIR3: U1.35(PB14) U20.2(PH/IN2)
DIR4: U1.36(PB15) U21.2(PH/IN2)
ENC1_A: R40.1 U1.50(PA15)
ENC1_B: R39.1 U1.55(PB3)
ENC2_A: R42.1 U1.37(PC6)
ENC2_B: R41.1 U1.38(PC7)
ENC3_A: R44.1 U1.58(PB6)
ENC3_B: R43.1 U1.59(PB7)
ENC4_A: R46.1 U1.14(PA0-WKUP)
ENC4_B: R45.1 U1.15(PA1)
ESTOP_ACTIVE: C90.1 CN7.2 R79.2 R80.2
I2C1_SCL: CN6.3 R50.2 U1.61(PB8) U22.5(SCL)
I2C1_SDA: CN6.4 R49.1 U1.62(PB9) U22.4(SDA)
I2C2_SCL: R69.2 U1.29(PB10) U27.26(SCL)
I2C2_SDA: R68.1 U1.30(PB11) U27.27(SDA)
M1_MOTOR1: CN10.1 U15.8(OUT1)
M1_MOTOR2: CN10.6 U15.10(OUT2)
M2_MOTOR1: CN11.1 U19.8(OUT1)
M2_MOTOR2: CN11.6 U19.10(OUT2)
M3_MOTOR1: CN12.1 U20.8(OUT1)
M3_MOTOR2: CN12.6 U20.10(OUT2)
M4_MOTOR1: CN13.1 U21.8(OUT1)
M4_MOTOR2: CN13.6 U21.10(OUT2)
MOTOR_EN: R37.1 U1.52(PC11) U15.3(nSLEEP) U19.3(nSLEEP) U20.3(nSLEEP) U21.3(nSLEEP) U28.1
NRF_3V3: C87.2 C88.2 H19.2 R75.2 R77.2
NRF_CE: H19.3 R76.1 U1.26(PB0)
NRF_CSN: H19.4 R77.1 U1.20(PA4)
NRF_IRQ: H19.8 U1.27(PB1)
NRF_MISO: H19.7 U1.22(PA6)
NRF_MOSI: H19.6 U1.23(PA7)
NRF_SCK: H19.5 U1.21(PA5)
NRST: C97.1 H17.5 KEY1.1 R14.1 U1.7(NRST)
OSC_IN: C24.2 R13.2 U1.5(PDO-OSC_IN) X5.1(OSC1)
OSC_OUT: C10.2 R13.1 U1.6(PD1-OSC_OUT) X5.3(OSC2)
PC0: R80.1 U1.8(PC0)
PWM1: U1.41(PA8) U15.1(EN/IN1)
PWM2: U1.42(PA9) U19.1(EN/IN1)
PWM3: U1.43(PA10) U20.1(EN/IN1)
PWM4: U1.44(PA11) U21.1(EN/IN1)
SERVO1_PWM: R56.1 U27.6(LED0)
SERVO2_PWM: R58.1 U27.7(LED1)
SERVO3_PWM: R60.1 U27.8(LED2)
SERVO4_PWM: R64.1 U27.9(LED3)
SERVO5_PWM: R66.1 U27.10(LED4)
SERVO6V_A: C69.1 C70.1 C72.2 C80.1 DUO1.2 KG30.2 L4.1(S) R52.1 U31.1
SERVO6V_B: C76.1 C77.1 C79.2 C81.1 DUO3.2 DUO4.2 KG25.2 L5.1(S) R54.1 U29.1
SERVO_OE_N: R70.1 R86.1 U1.53(PC12) U27.23(OE#) U32.1
STATUS_LED: LED1.1(C) U1.2(PC13-TAMPER-RTC)
SWCLK: H17.4 U1.49(PA14)
SWDIO: H17.2 U1.46(PA13)
VM_12V: C26.2 C27.2 C31.2 C32.2 C36.2 C37.2 C41.2 C42.2 C46.2 C47.1 C55.2 C56.1 C60.2 C65.1 C66.1 C67.1 C68.2 C73.1 C74.1 C75.2 C92.1 C94.1 C95.1 C96.1 D1.1(K) R48.2 R87.1 U15.11(VM) U19.11(VM) U20.11(VM) U21.11(VM) U22.8(VBUS) U23.1(VIN) U25.5(VIN) U26.5(VIN) U34.1
VREF_SET: C28.2 C33.2 C38.2 C43.2 C45.2 R27.1 R28.1 U15.5(VREF) U19.5(VREF) U20.5(VREF) U21.5(VREF)
$1N4387: LED1.2(A) R18.1
$1N5949: C84.1 C85.1 R74.2 U1.13(VDDA)
$2N2257: C25.1 U15.14(CPL)
$2N2292: C25.2 U15.13(CPH)
$2N2297: C26.1 U15.12(VCP)
$2N2730: R29.2 U15.6(IPROPI)
$2N4081: C30.1 U19.14(CPL)
$2N4083: C30.2 U19.13(CPH)
$2N4086: C31.1 U19.12(VCP)
$2N4103: R31.2 U19.6(IPROPI)
$2N4591: C35.1 U20.14(CPL)
$2N4593: C35.2 U20.13(CPH)
$2N4596: C36.1 U20.12(VCP)
$2N4613: R33.2 U20.6(IPROPI)
$2N5101: C40.1 U21.14(CPL)
$2N5103: C40.2 U21.13(CPH)
$2N5106: C41.1 U21.12(VCP)
$2N5123: R35.2 U21.6(IPROPI)
$2N6699: CN11.3 R41.2
$2N6732: CN11.4 R42.2
$2N6800: CN12.3 R43.2
$2N6836: CN12.4 R44.2
$2N18106: CN13.3 R45.2
$2N18108: CN13.4 R46.2
$2N18110: CN10.3 R39.2
$2N18112: CN10.4 R40.2
$3N366: C52.2 R47.1 U22.10(VIN+)
$3N371: C52.1 R48.1 U22.9(VIN-)
$3N1615: D2.2(K) L1.1 U23.2(OUT)
$3N2899: C68.1 U25.4(VC)
$3N4967: D3.1(C) L4.2(F) U25.3(SW) U25.6(SW)
$3N5325: C72.1 R52.2 R53.1 U25.2(FB)
$3N6011: C75.1 U26.4(VC)
$3N6016: D4.1(C) L5.2(F) U26.3(SW) U26.6(SW)
$3N6038: C79.1 R54.2 R55.1 U26.2(FB)
$4N1533: DUO3.3 R60.2 R61.1
$4N1539: DUO4.3 R64.2 R65.1
$4N1545: KG25.3 R66.2 R67.1
$4N1714: DUO1.3 R56.2 R57.1
$4N1875: KG30.3 R58.2 R59.1
$7N1028: BUZZER1.2 D10.2(A) Q1.3(C) R81.1
$7N1434: Q1.1(B) R85.1
$8N704: CN9.3 R83.2
$8N740: CN9.4 R84.2

Not connected (* = marked no-connect by the designer): CN5 3* 4*; CN7 3* 4*; U1 3(PC14-OSC32_IN)* 4(PC15-OSC32_OUT)* 9(PC1)* 10(PC2)* 11(PC3)* 24(PC4)* 25(PC5)* 39(PC8)* 40(PC9)* 45(PA12)* 54(PD2)* 56(PB4)* 57(PB5)*; U15 4(nFAULT)*; U19 4(nFAULT)*; U20 4(nFAULT)*; U21 4(nFAULT)*; U22 3(Alert)*; U24 4(NC)*; U27 11(LED5)* 12(LED6)* 13(LED7)* 15(LED8)* 16(LED9)* 17(LED10)* 18(LED11)* 19(LED12)* 20(LED13)* 21(LED14)* 22(LED15)*

## Notes on the sheets
sheet 3
- 两路舵机6V电源
- 电源检测模块
